# EasyEDA Pro project МПА-регистратор.eprj, schematic Schematic1

## Sheets
1 MCU: Board Name: Board1; Create Date: 2026-05-29; Page Name: MCU; Project Name: МПА-регистратор; Schematic Name: Schematic1; Update Date: 2026-09-03; Company: EasyEDA.com; Page Size: A4; Version: V1.0
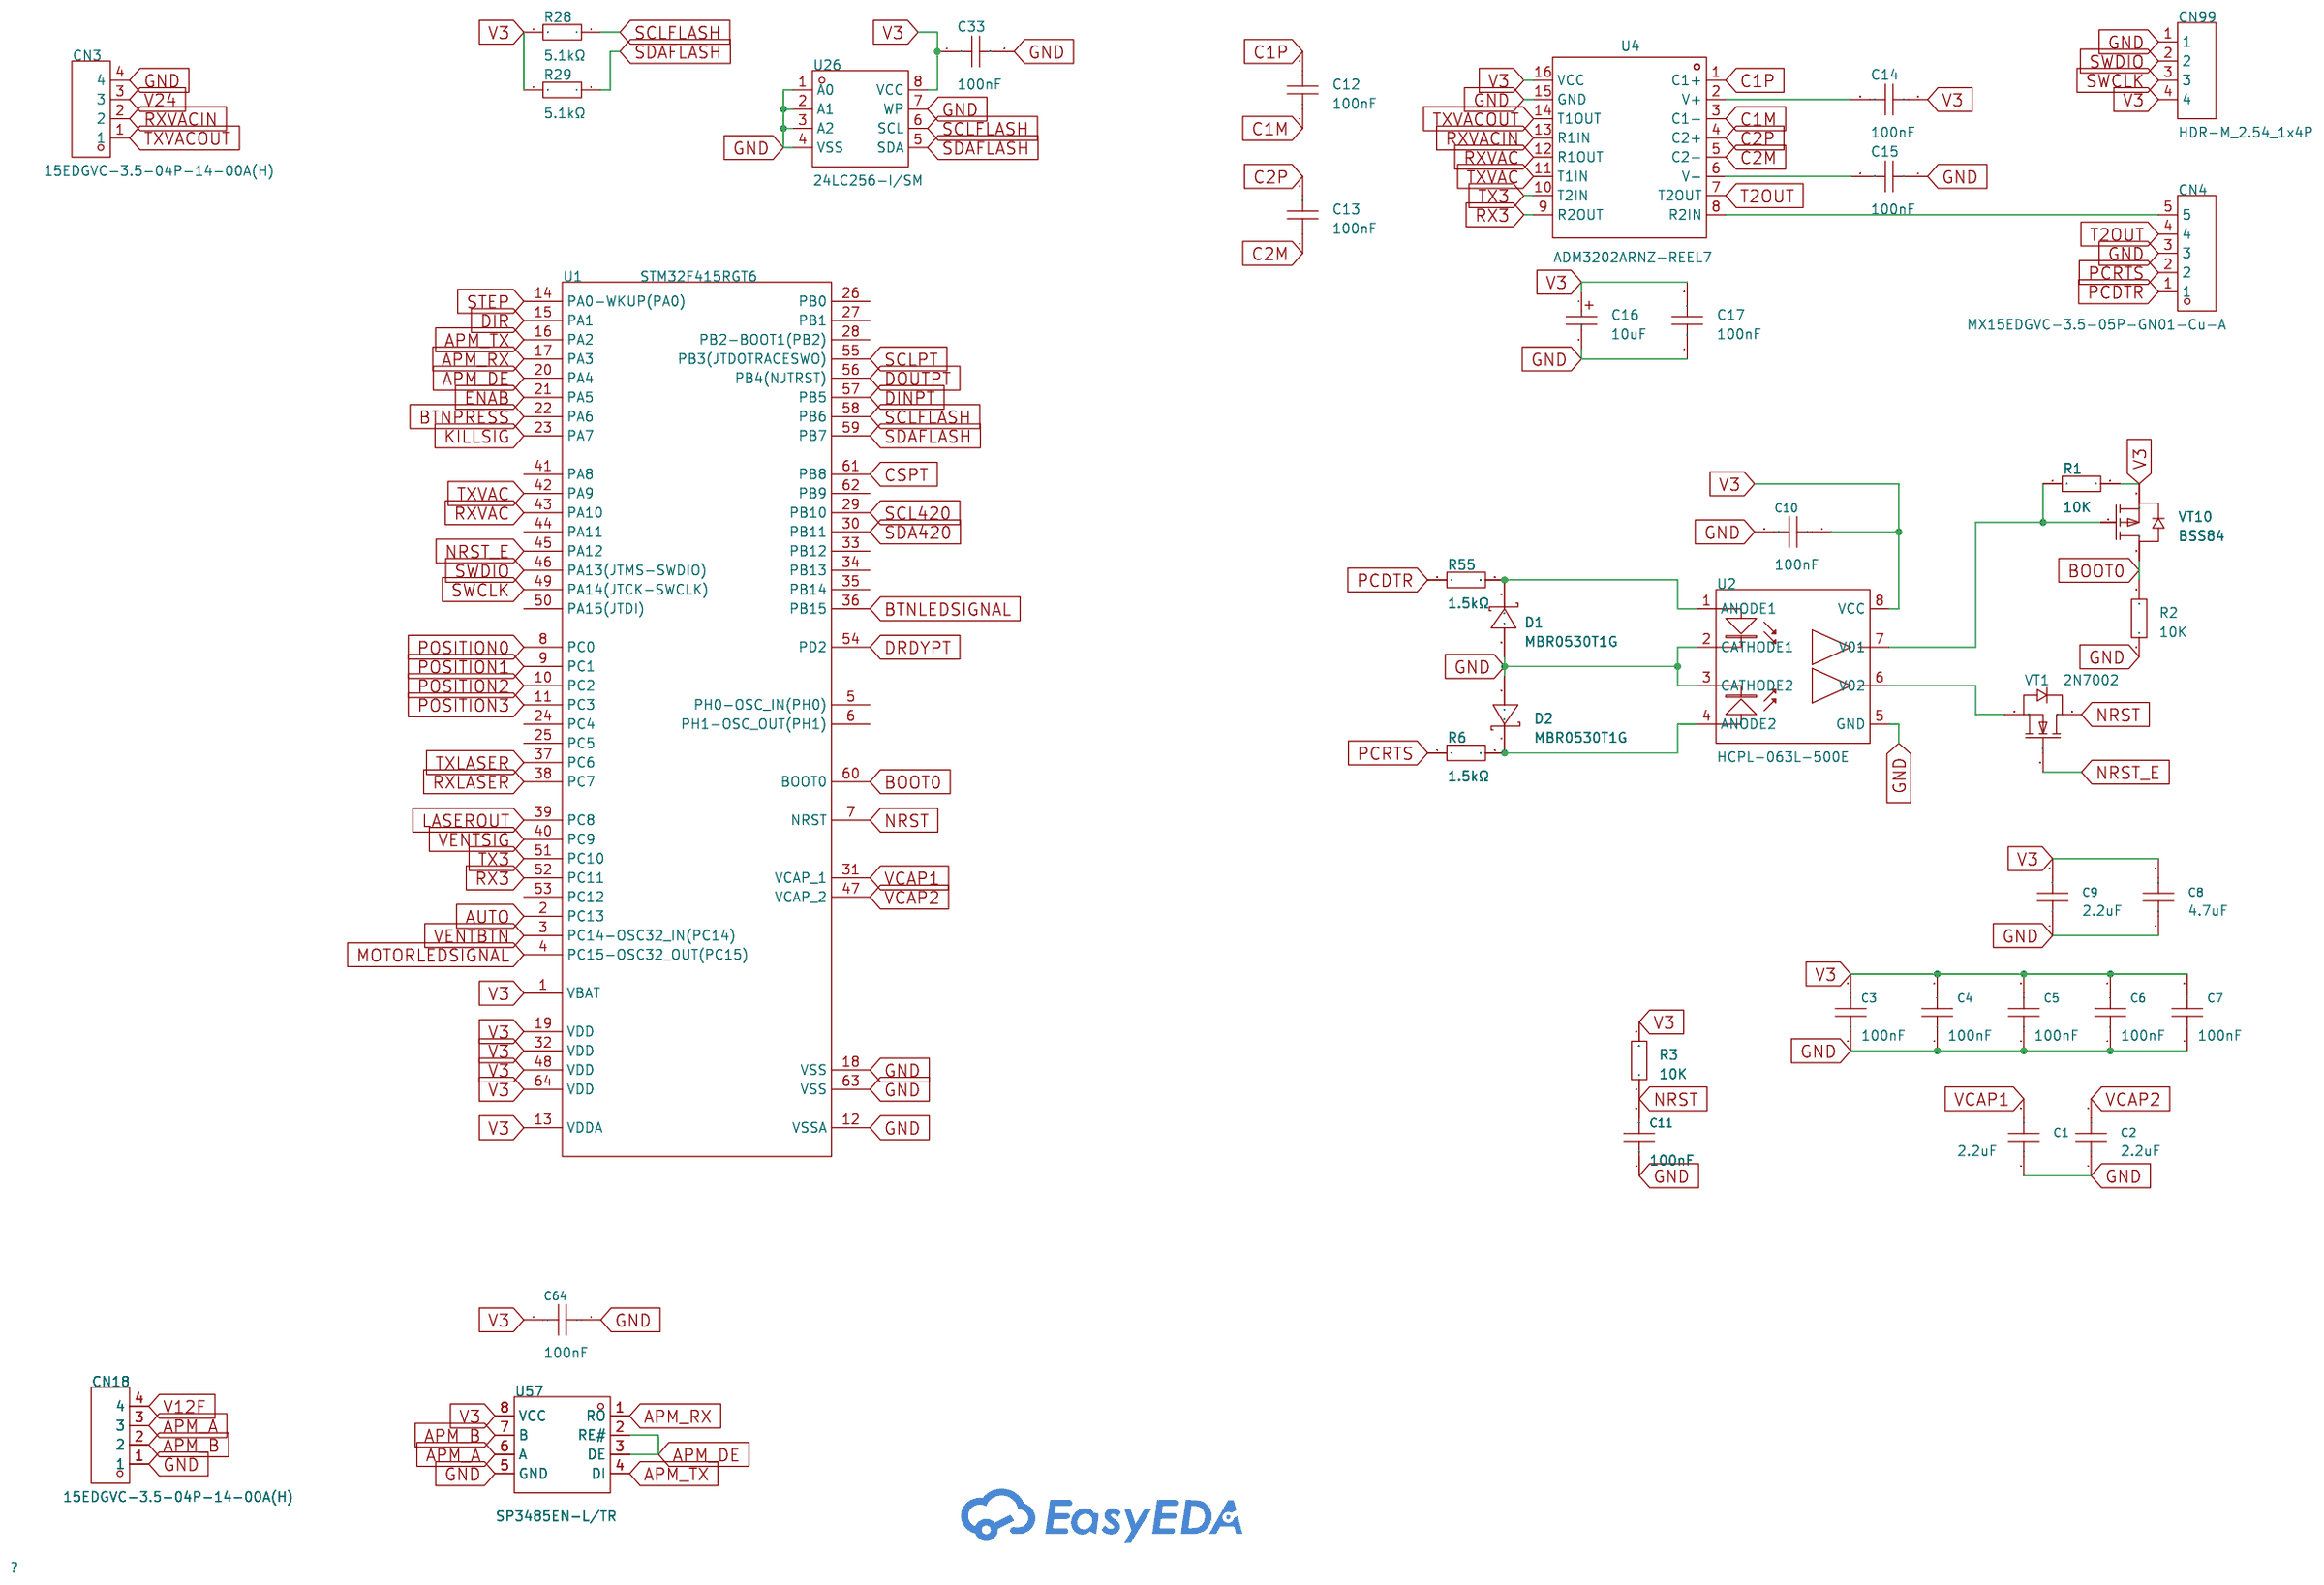
[diagram p0: MCU]
2 4-20: Create Date: 2026-06-09; Page Name: 4-20; Update Date: 2026-07-08
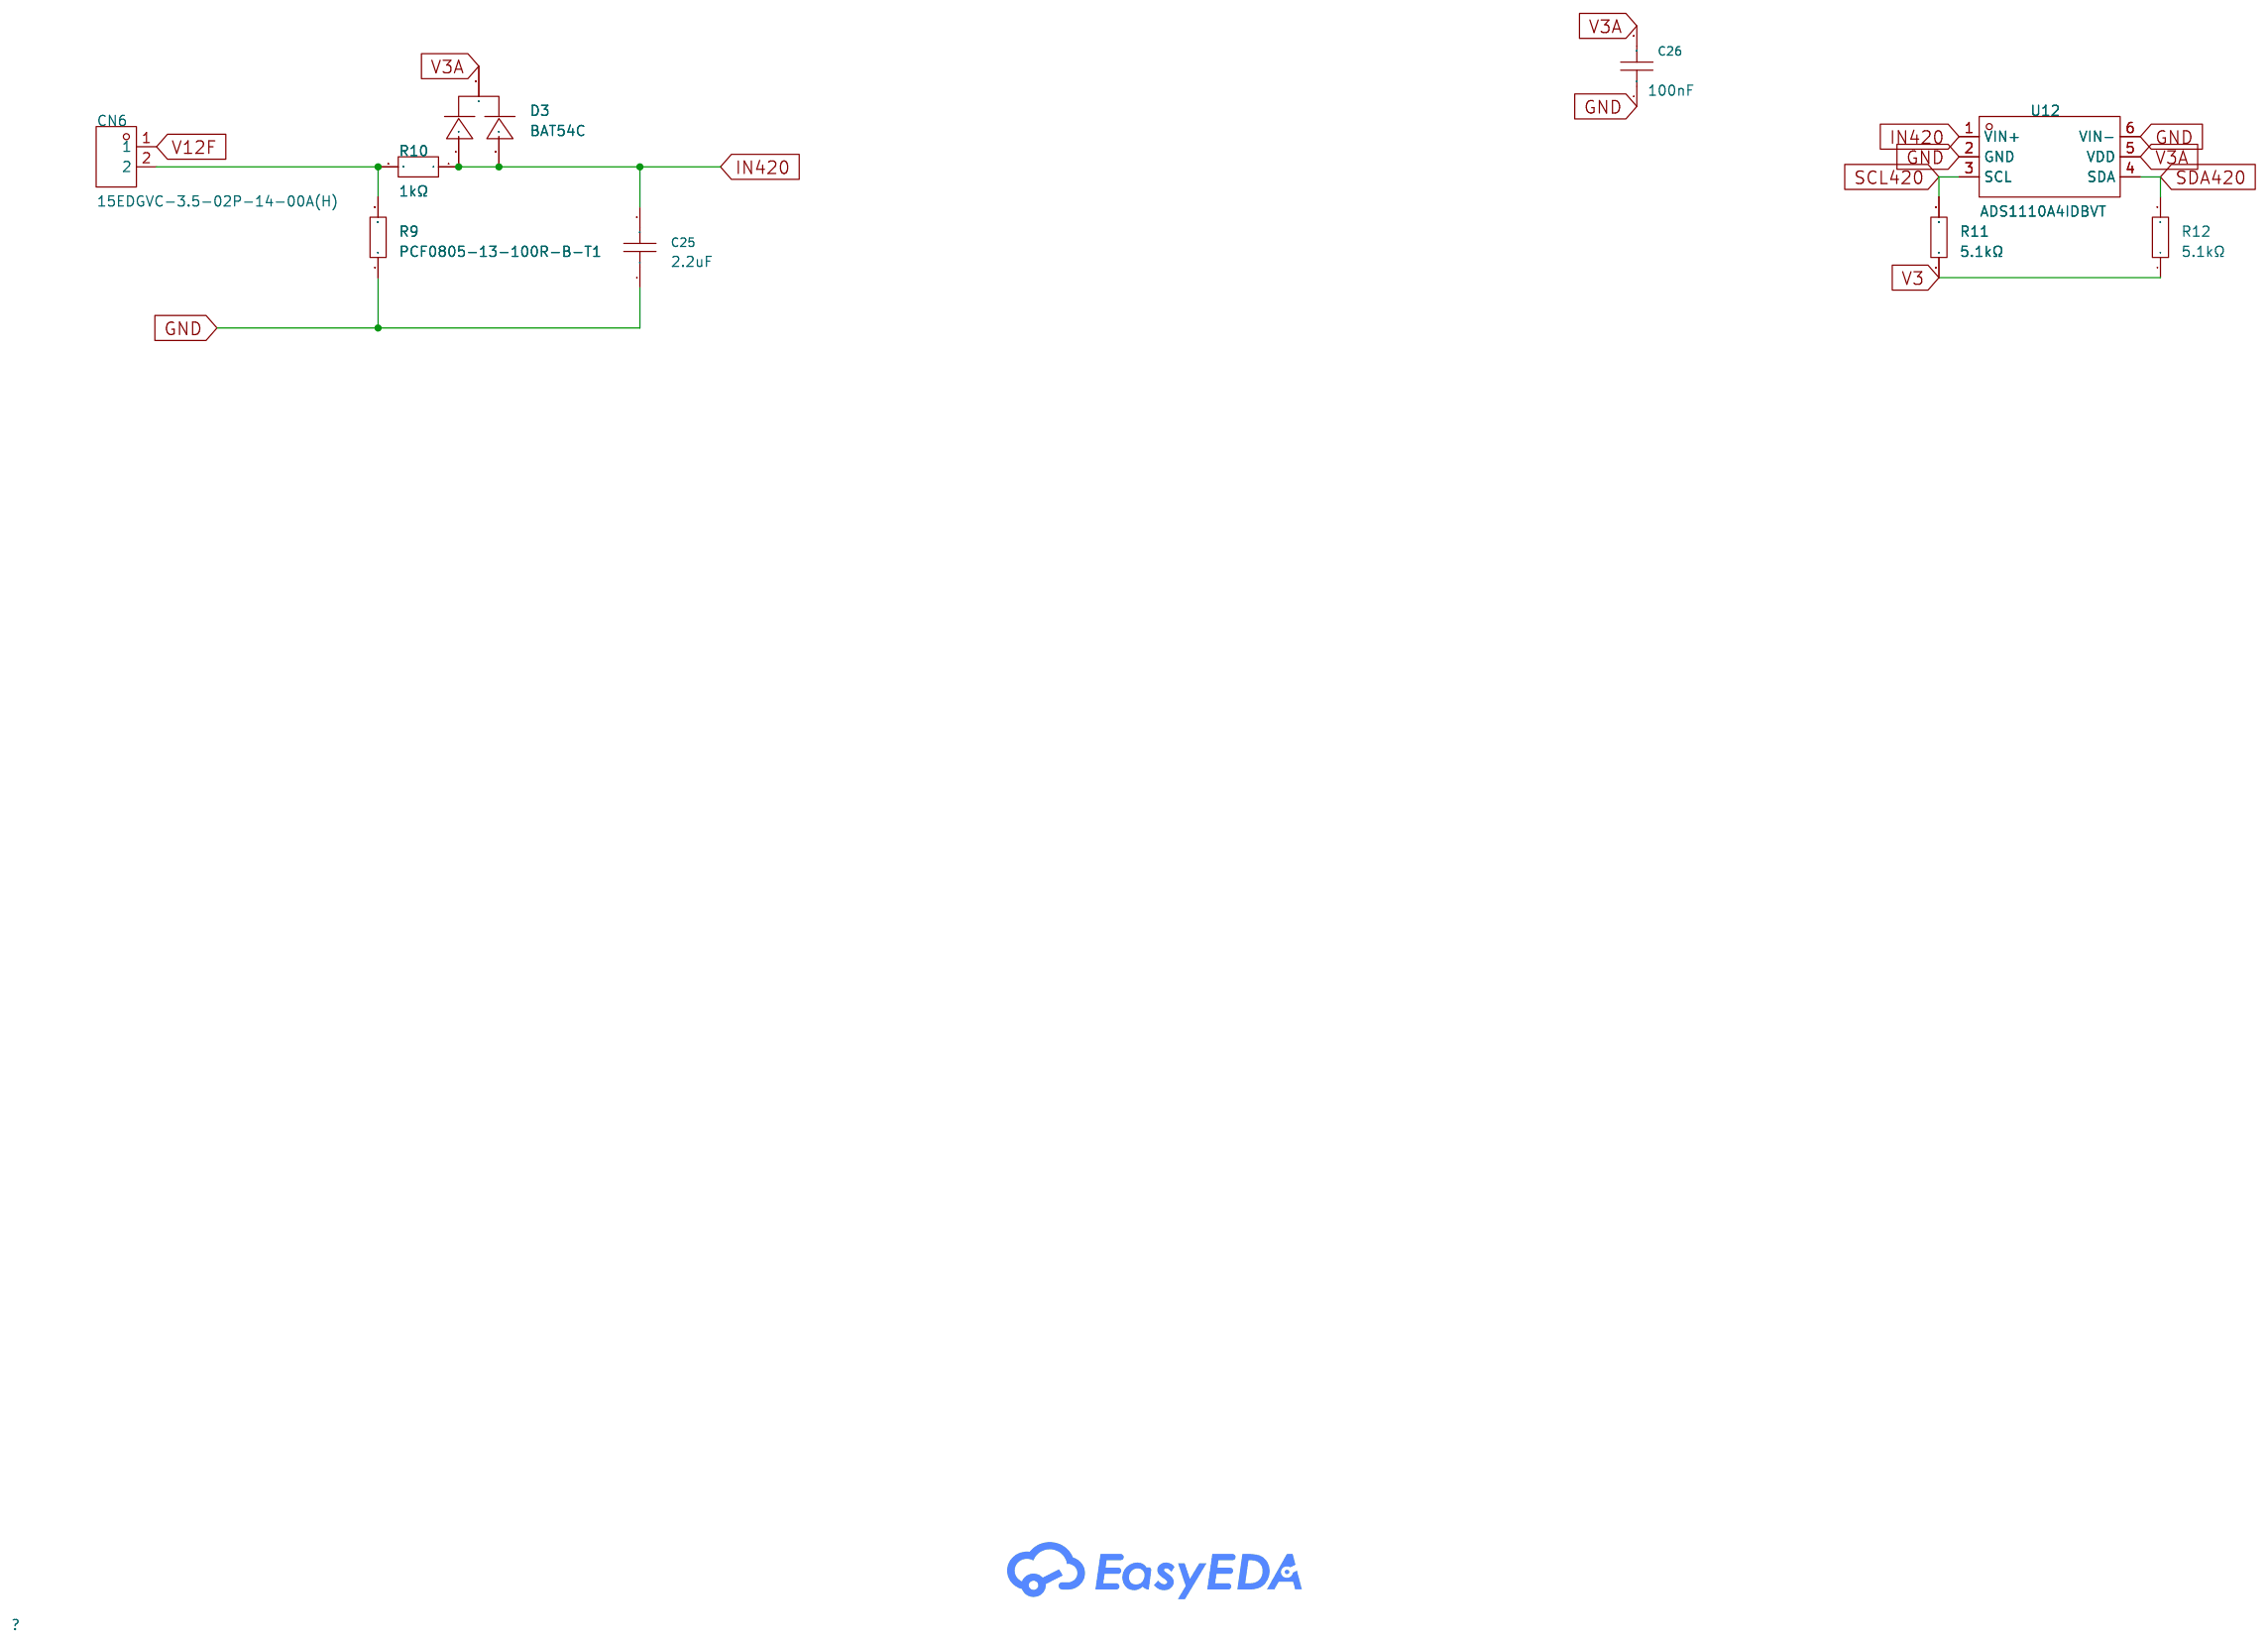
[diagram p1: 4-20]
3 Stepper: Create Date: 2026-06-09; Page Name: Stepper
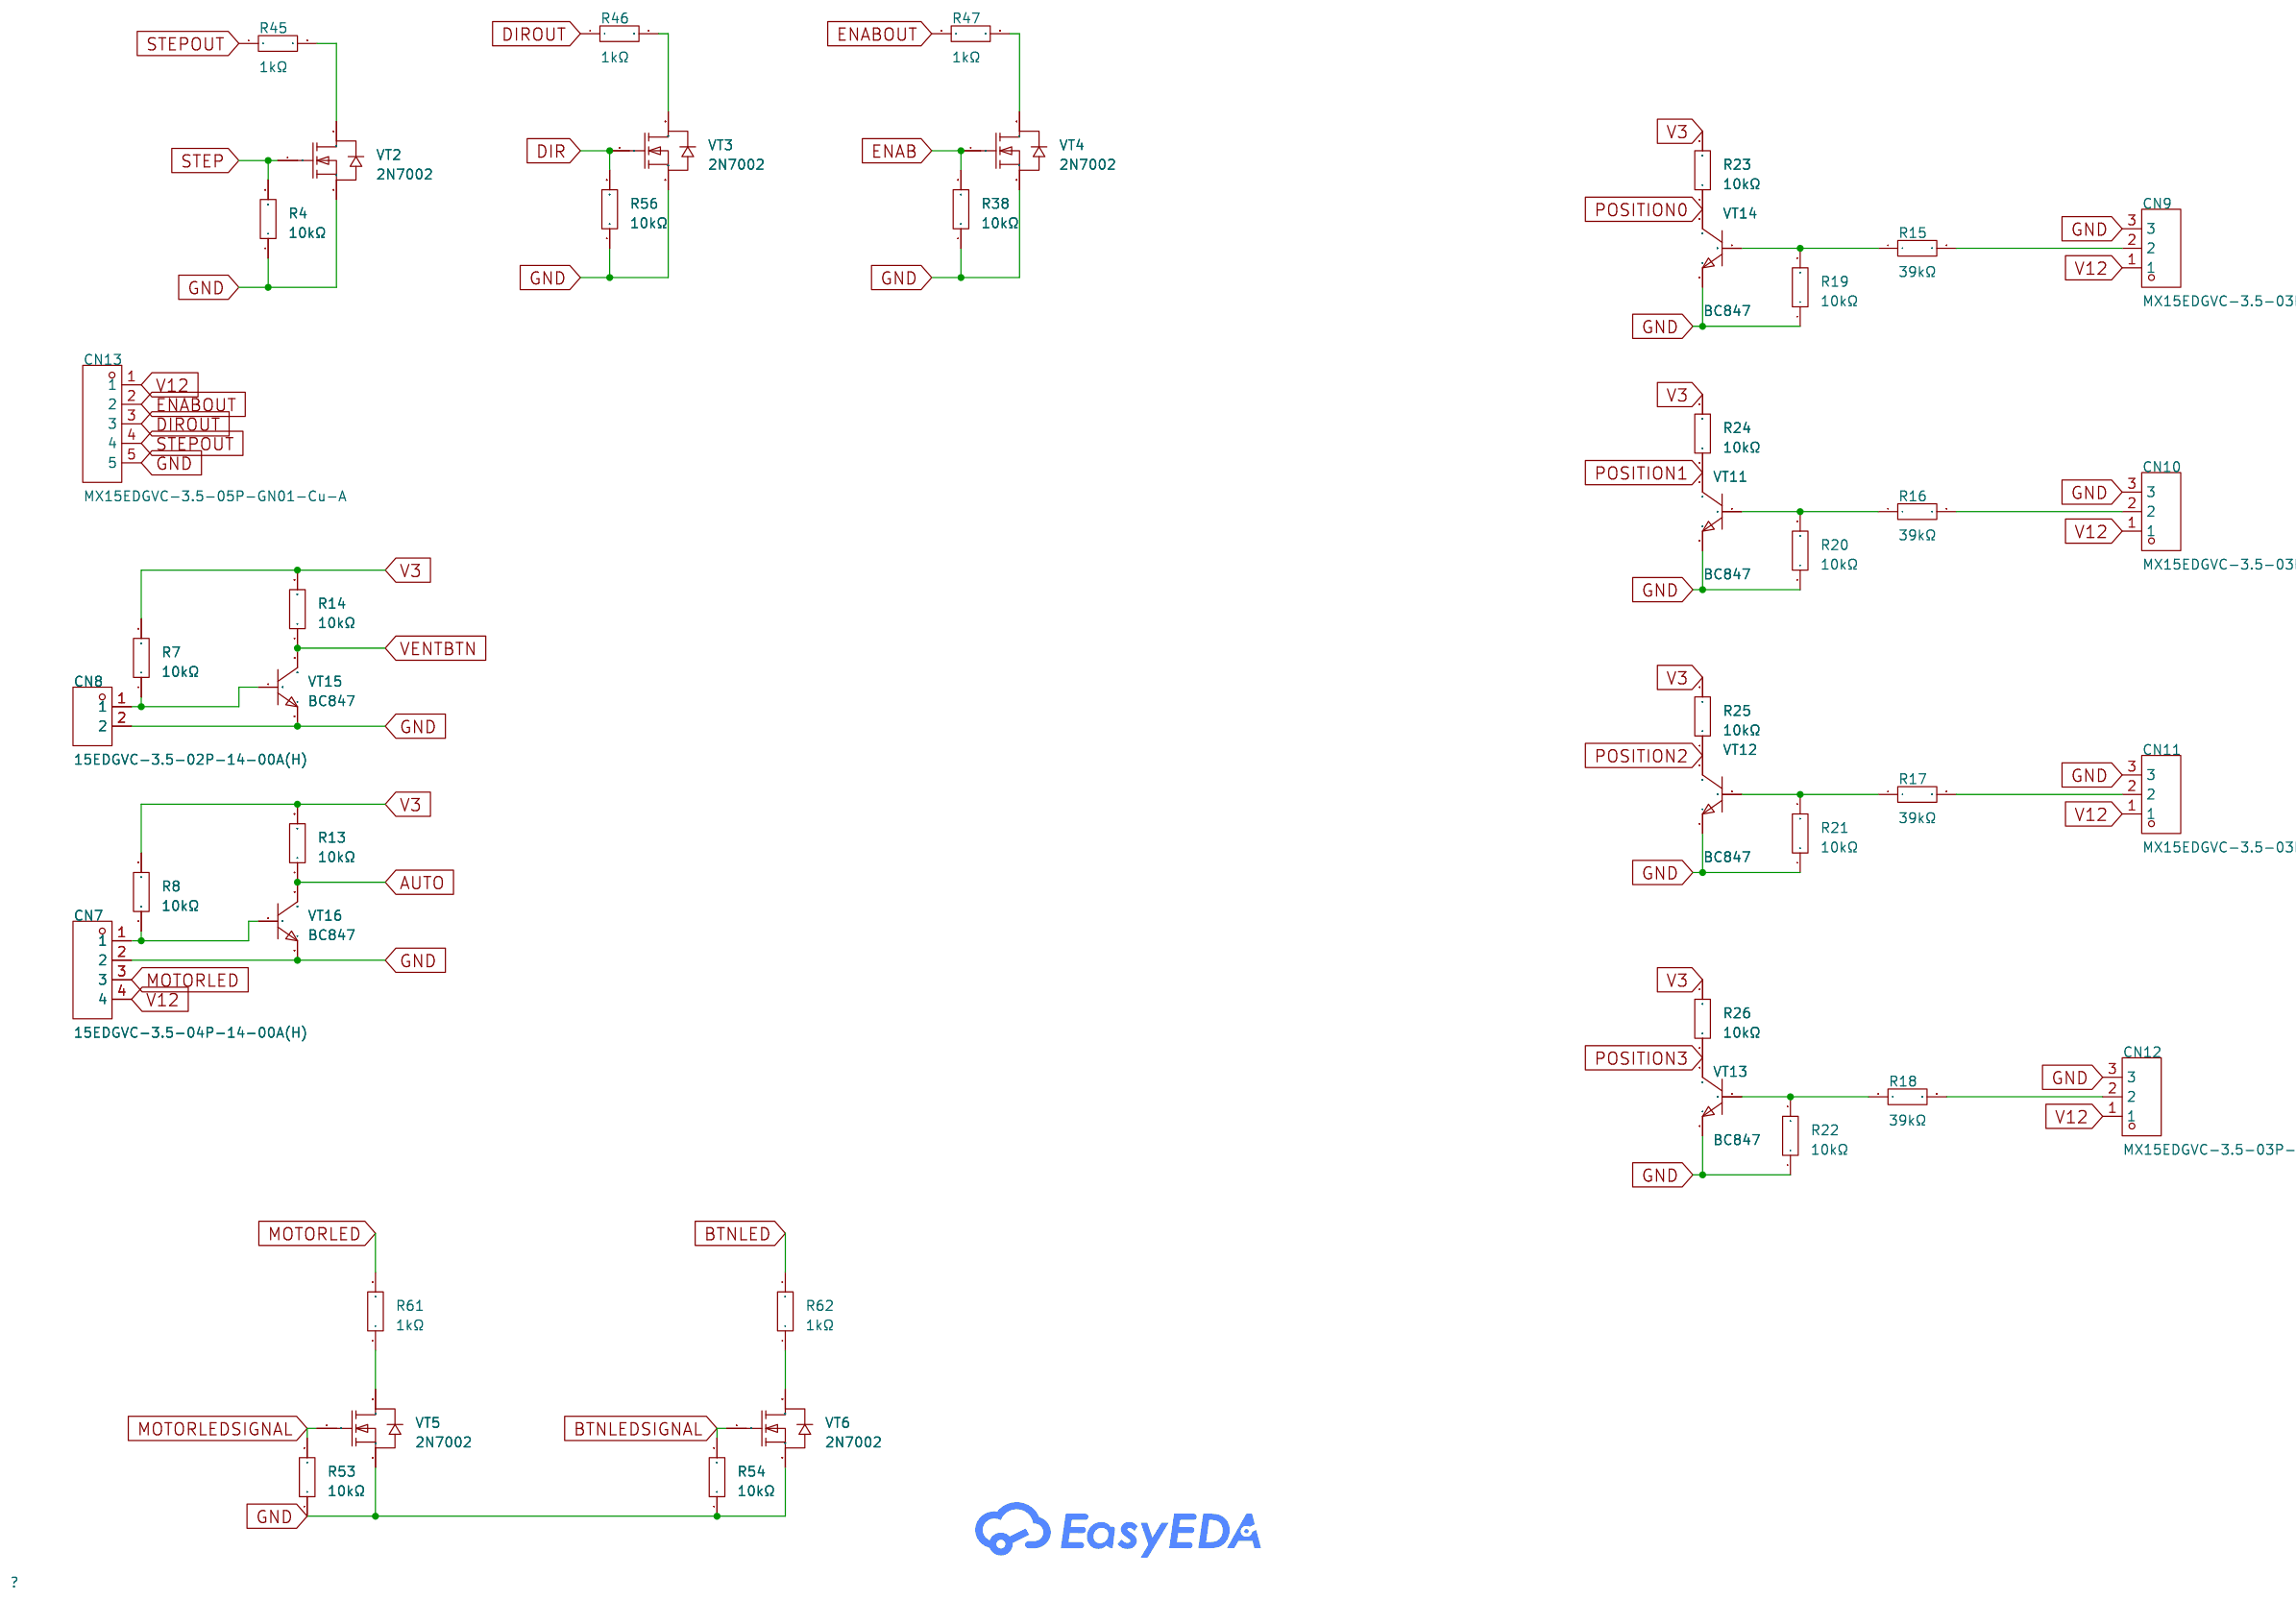
[diagram p2: Stepper]
4 Laser: Create Date: 2026-06-11; Page Name: Laser; Update Date: 2026-07-07
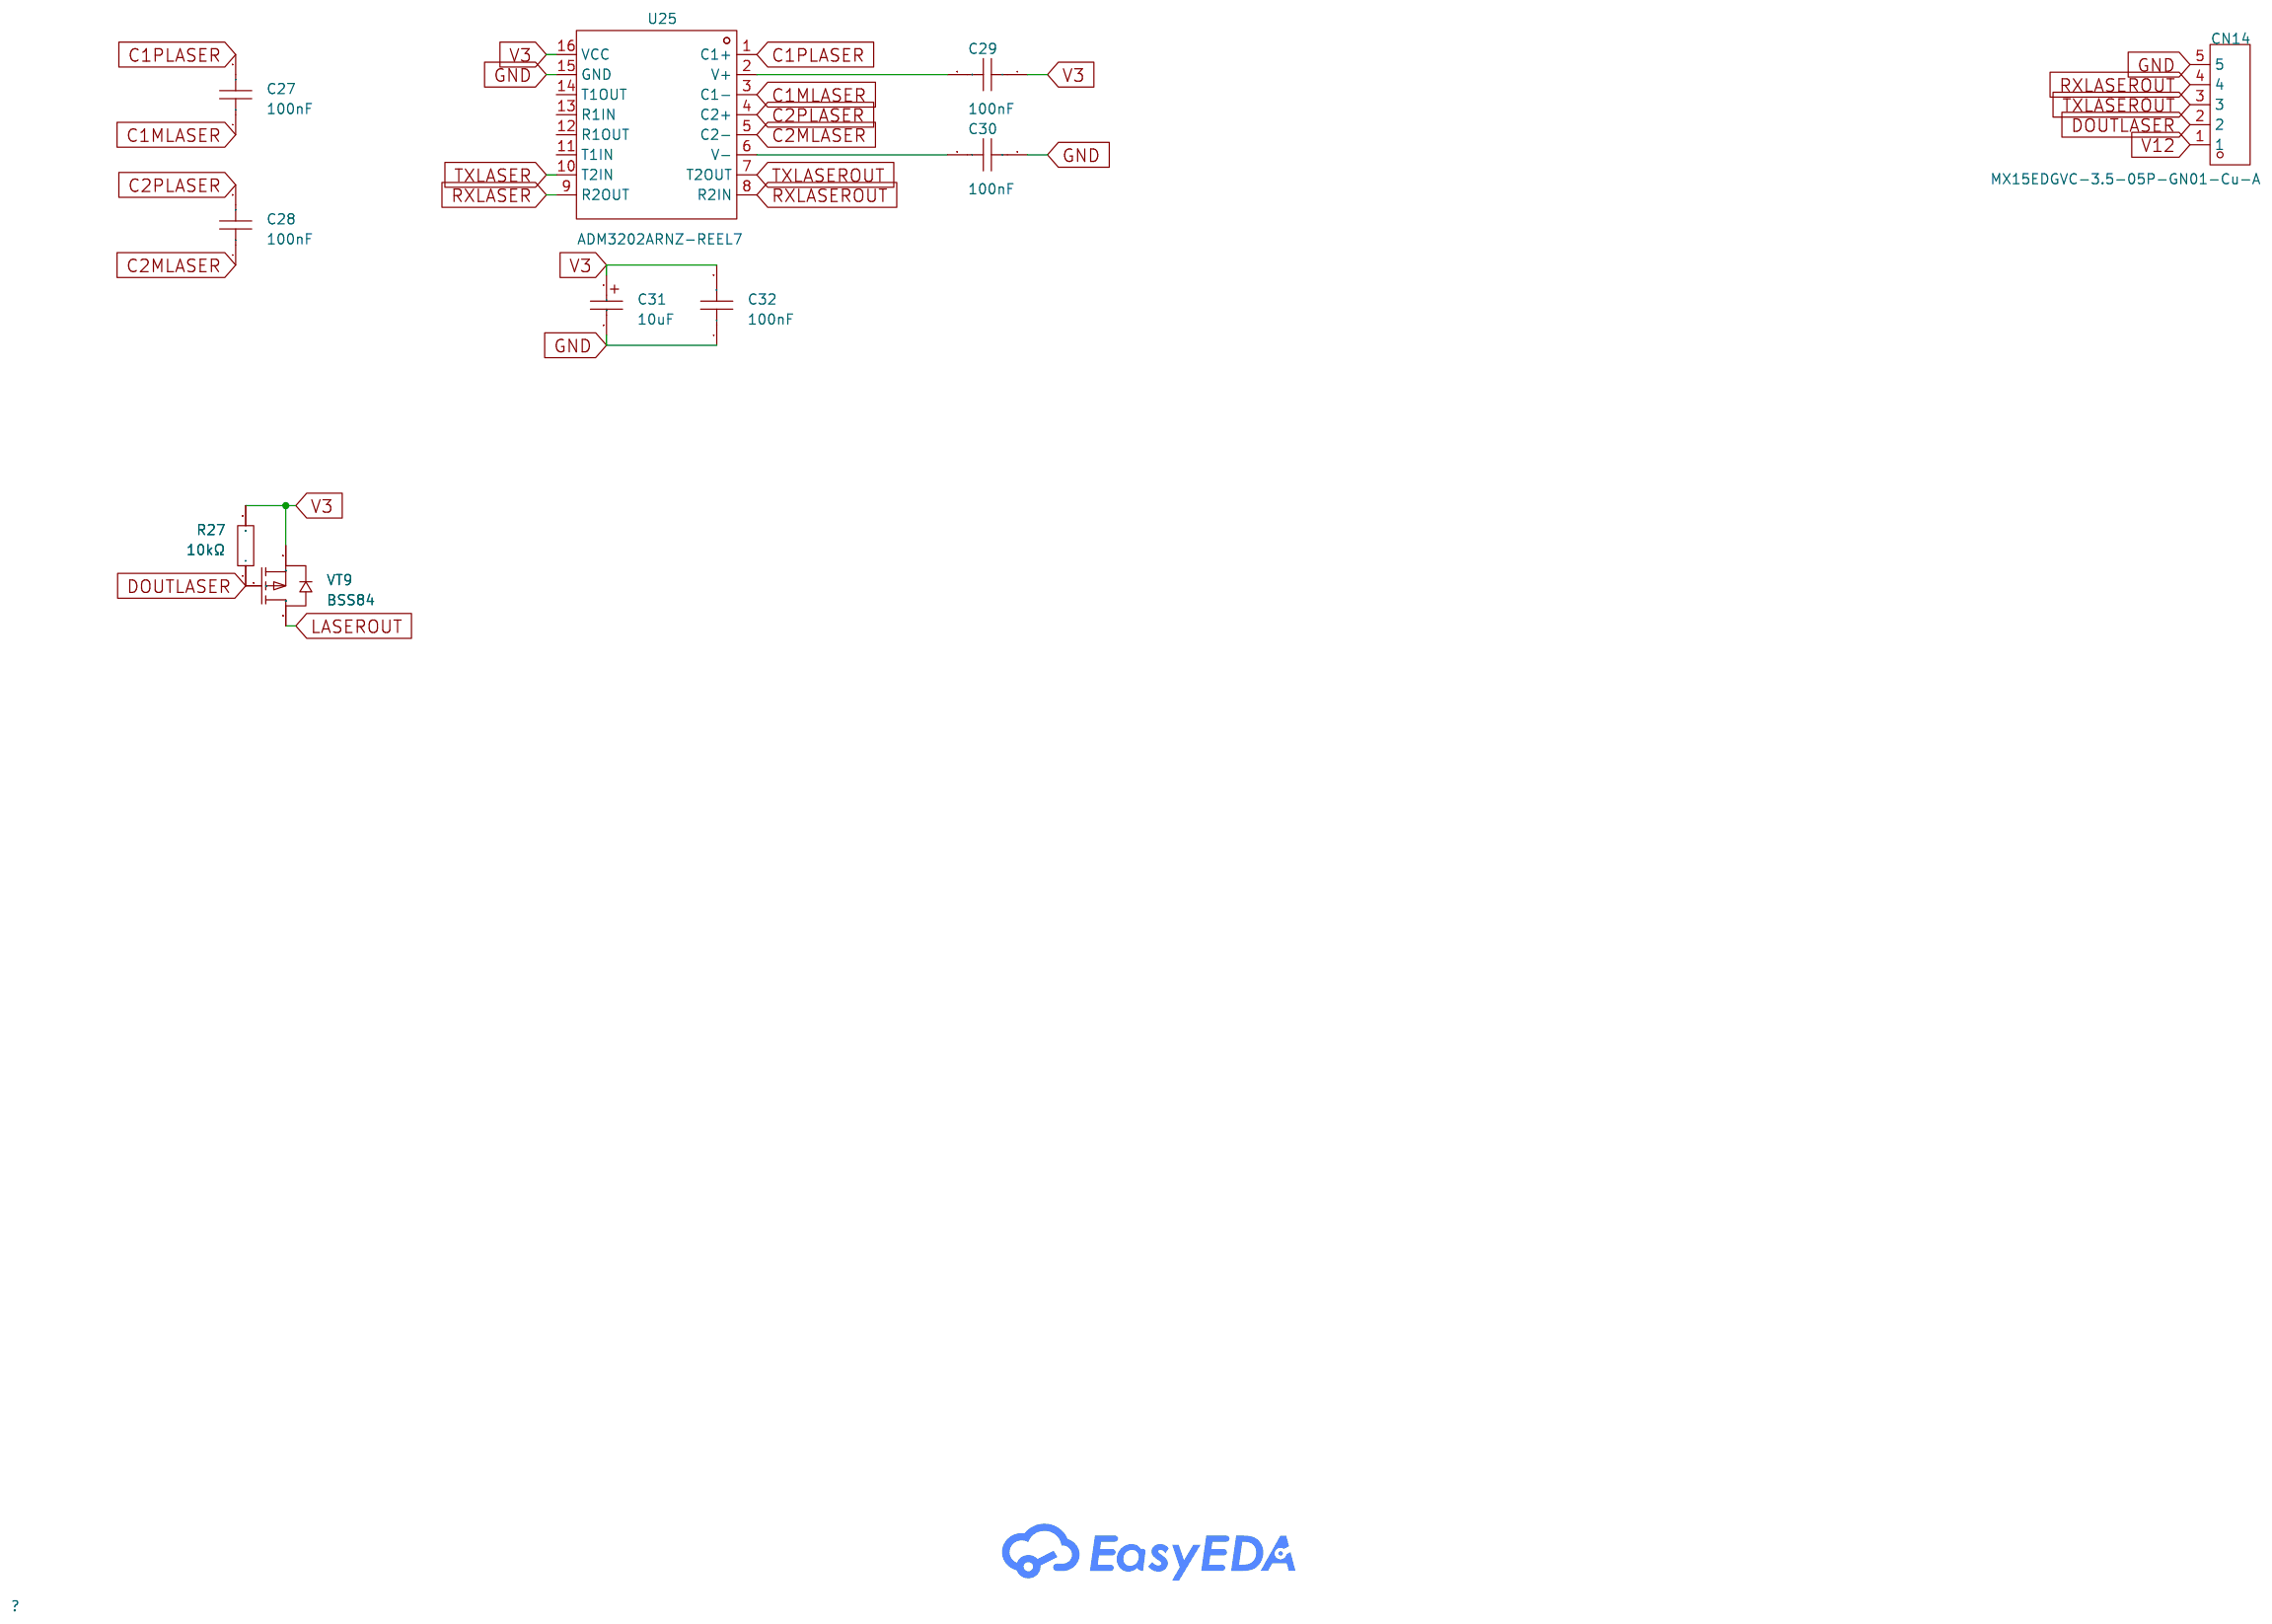
[diagram p3: Laser]
5 PWR: Create Date: 2026-06-11; Page Name: PWR; Update Date: 2026-07-08
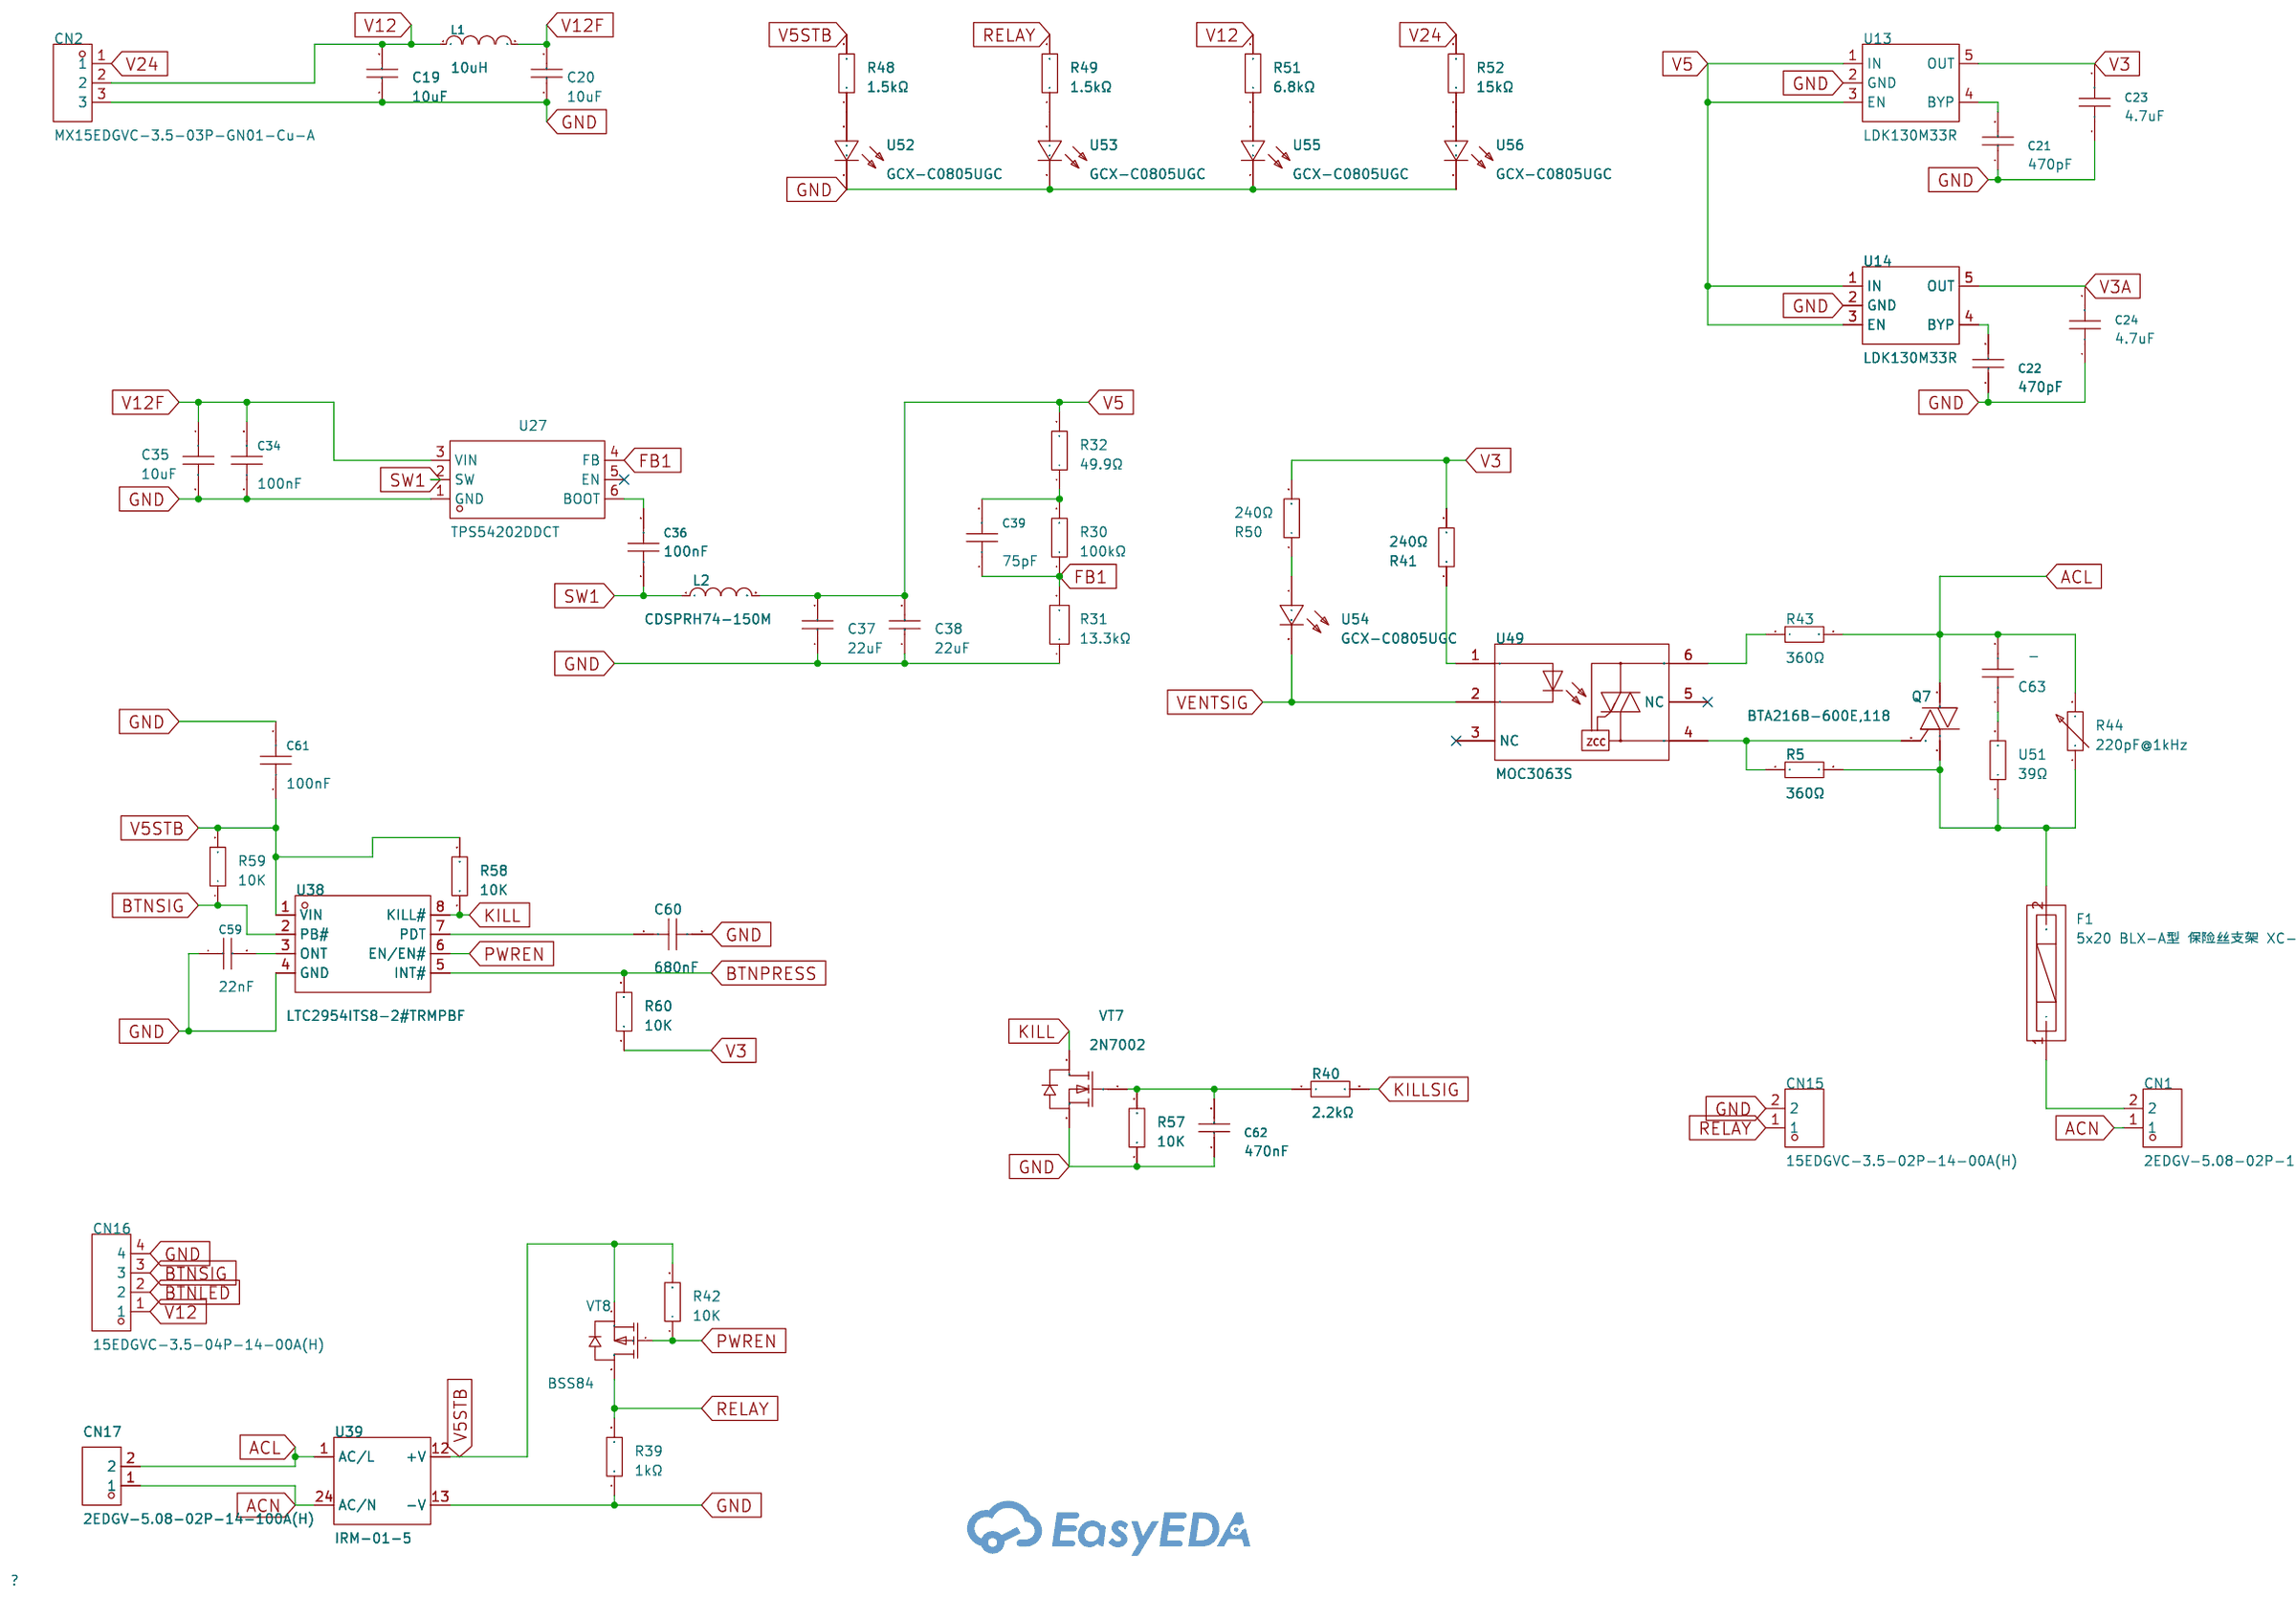
[diagram p4: PWR]
6 Pt100: Create Date: 2026-06-11; Page Name: Pt100; Update Date: 2026-06-30
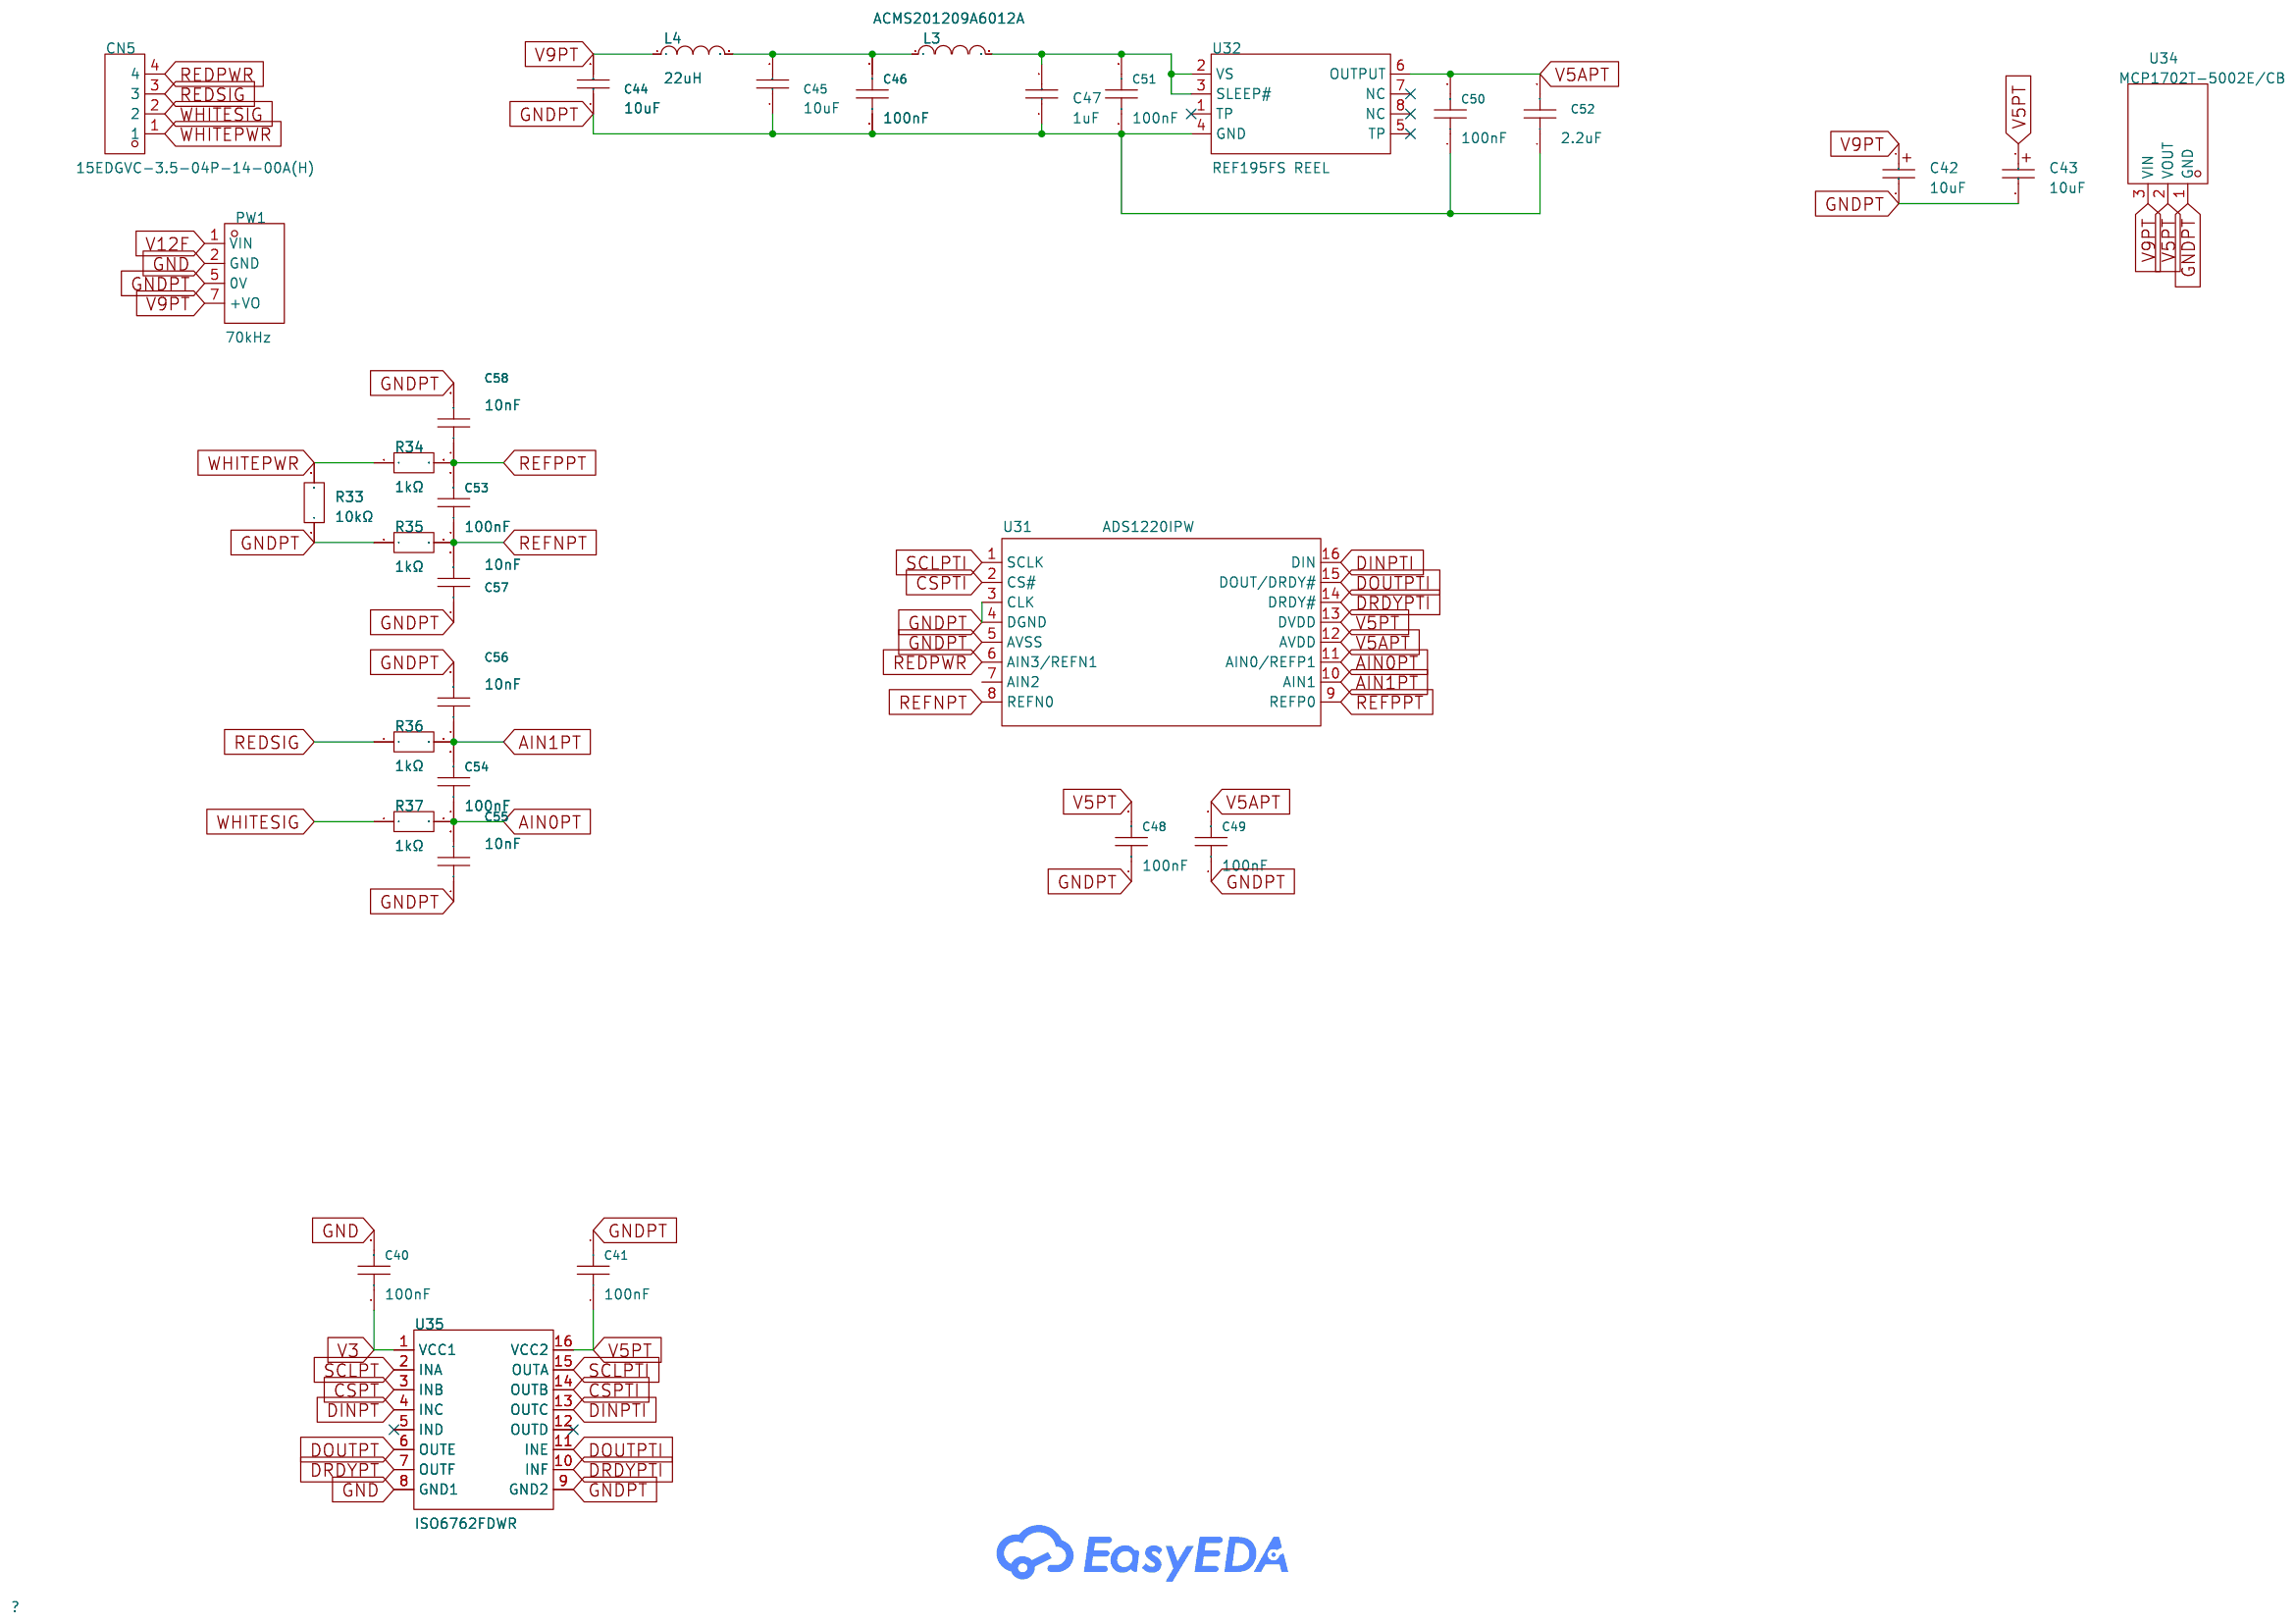
[diagram p5: Pt100]

## Parts
sheet 4-20
C25  2.2uF  [C0603]
C26  100nF  [C0603]
CN6  15EDGVC-3.5-02P-14-00A(H)  [CONN-TH_2P-P3.50_15EDGVC-3.5-02P-14-00AH]
D3  BAT54C  [SOT-23-3_L3.0-W1.7-P0.95-LS2.9-BR]
R9  100Ω  [R0805]
R10  1kΩ  [R0805]
R11  5.1kΩ  [R0805]
R12  5.1kΩ  [R0805]
U12  ADS1110A4IDBVT  [SOT-23-6_L2.9-W1.6-P0.95-LS2.8-BR]
sheet Laser
C27  100nF  [C0805]
C28  100nF  [C0805]
C29  100nF  [C0805]
C30  100nF  [C0805]
C31  10uF  [CASE-A_3216]
C32  100nF  [C0805]
CN14  MX15EDGVC-3.5-05P-GN01-Cu-A  [CONN-TH_5P-P3.50_MX15EDGV-3.5-GN01-05P-CU-A]
R27  10kΩ  [R0805]
U25  ADM3202ARNZ-REEL7  [SOIC-16_L9.9-W3.9-P1.27-LS6.0-BL]
VT9  BSS84  [SOT-23_L2.9-W1.3-P1.90-LS2.4-BR]
sheet MCU
C1  2.2uF  [C0603]
C2  2.2uF  [C0603]
C3  100nF  [C0603]
C4  100nF  [C0603]
C5  100nF  [C0603]
C6  100nF  [C0603]
C7  100nF  [C0603]
C8  4.7uF  [C0603]
C9  2.2uF  [C0603]
C10  100nF  [C0603]
C11  100nF  [C0603]
C12  100nF  [C0805]
C13  100nF  [C0805]
C14  100nF  [C0805]
C15  100nF  [C0805]
C16  10uF  [CASE-A_3216]
C17  100nF  [C0805]
C33  100nF  [C0805]
C64  100nF  [C0603]
CN3  15EDGVC-3.5-04P-14-00A(H)  [CONN-TH_4P-P3.50_TOPONELEC_15ETYVC-3.5-04P-14-00AH]
CN4  MX15EDGVC-3.5-05P-GN01-Cu-A  [CONN-TH_5P-P3.50_MX15EDGV-3.5-GN01-05P-CU-A]
CN18  15EDGVC-3.5-04P-14-00A(H)  [CONN-TH_4P-P3.50_TOPONELEC_15ETYVC-3.5-04P-14-00AH]
CN99  HDR-M_2.54_1x4P  [HDR-TH_HDR-M_2.54_1X4P]
D1  MBR0530T1G  [SOD-123_L2.7-W1.6-LS3.7-RD-1]
D2  MBR0530T1G  [SOD-123_L2.7-W1.6-LS3.7-RD-1]
R1  10K  [R0805]
R2  10K  [R0805]
R3  10K  [R0805]
R6  1.5kΩ  [R0805]
R28  5.1kΩ  [R0805]
R29  5.1kΩ  [R0805]
R55  1.5kΩ  [R0805]
U1  STM32F415RGT6  [LQFP-64_L10.0-W10.0-P0.50-LS12.0-BL]
U2  HCPL-063L-500E  [SO-8_L4.9-W3.9-P1.27-LS5.9-BL]
U4  ADM3202ARNZ-REEL7  [SOIC-16_L9.9-W3.9-P1.27-LS6.0-BL]
U26  24LC256-I/SM  [SOIJ-8_L5.3-W5.3-P1.27-LS7.9-BL]
U57  SP3485EN-L/TR  [SOIC-8_L5.0-W4.0-P1.27-LS6.0-BL]
VT1  2N7002  [SOT-23-3_L2.9-W1.4-P1.91-LS2.6-BR]
VT10  BSS84  [SOT-23_L2.9-W1.3-P1.90-LS2.4-BR]
sheet Pt100
C40  100nF  [C0603]
C41  100nF  [C0603]
C42  10uF  [CASE-A_3216]
C43  10uF  [CASE-A_3216]
C44  10uF  [C1210]
C45  10uF  [C1210]
C46  100nF  [C0603]
C47  1uF  [C0805]
C48  100nF  [C0603]
C49  100nF  [C0603]
C50  100nF  [C0603]
C51  100nF  [C0603]
C52  2.2uF  [C0603]
C53  100nF  [C0603]
C54  100nF  [C0603]
C55  10nF  [C0603]
C56  10nF  [C0603]
C57  10nF  [C0603]
C58  10nF  [C0603]
CN5  15EDGVC-3.5-04P-14-00A(H)  [CONN-TH_4P-P3.50_TOPONELEC_15ETYVC-3.5-04P-14-00AH]
L3  ACMS201209A6012A  [L0805]
L4  22uH  [IND-SMD_L4.5-W3.2]
PW1  70kHz  [PWRM-TH_JETEKPS_HXXXXS-1W_1]
R33  10kΩ  [R0805]
R34  1kΩ  [R0603]
R35  1kΩ  [R0603]
R36  1kΩ  [R0603]
R37  1kΩ  [R0603]
U31  ADS1220IPW  [TSSOP-16_L5.0-W4.4-P0.65-LS6.4-BL]
U32  REF195FS REEL  [SOIC-8_L4.9-W3.9-P1.27-LS6.0-BL]
U34  MCP1702T-5002E/CB  [SOT-23_L2.9-W1.3-P1.90-LS2.4-BR]
U35  ISO6762FDWR  [SOIC-16_L10.3-W7.5-P1.27-LS10.3-TL]
sheet PWR
C19  10uF  [C1206]
C20  10uF  [C1206]
C21  470pF  [C0805]
C22  470pF  [C0805]
C23  4.7uF  [C0603]
C24  4.7uF  [C0603]
C34  100nF  [C0603]
C35  10uF  [C1206]
C36  100nF  [C0603]
C37  22uF  [C1206]
C38  22uF  [C1206]
C39  75pF  [C0805]
C59  22nF  [C0805]
C60  680nF  [C0805]
C61  100nF  [C0603]
C62  470nF  [C0805]
C63  -  [CAP-TH_L13.0-W4.0-P10.00-D1.0]
CN1  2EDGV-5.08-02P-14-100A(H)  [CONN-TH_P5.08_2EDGV-5.08-02P-14-100A-H]
CN2  MX15EDGVC-3.5-03P-GN01-Cu-A  [CONN-TH_3P-P3.50_MX15EDGV-3.5-GN01-03P-CU-A]
CN15  15EDGVC-3.5-02P-14-00A(H)  [CONN-TH_2P-P3.50_15EDGVC-3.5-02P-14-00AH]
CN16  15EDGVC-3.5-04P-14-00A(H)  [CONN-TH_4P-P3.50_TOPONELEC_15ETYVC-3.5-04P-14-00AH]
CN17  2EDGV-5.08-02P-14-100A(H)  [CONN-TH_P5.08_2EDGV-5.08-02P-14-100A-H]
F1  5x20 BLX-A型 保险丝支架 XC-7  [FUSE-TH_L22.6-W9.0]
L1  10uH  [IND-SMD_L4.0-W4.0_SMNR4012]
L2  CDSPRH74-150M  [IND-SMD_L7.3-W7.3]
Q7  BTA216B-600E,118  [D2PAK_L10.2-W9.0-P5.08-LS15.9-BR]
R5  360Ω  [R1206]
R30  100kΩ  [R0805_NEW]
R31  13.3kΩ  [R0805]
R32  49.9Ω  [R0805]
R39  1kΩ  [R0805]
R40  2.2kΩ  [R0805]
R41  240Ω  [R0805]
R42  10K  [R0805]
R43  360Ω  [R1206]
R44  220pF@1kHz  [RES-TH_L12.5-W5.1-P7.50-D0.9-S5.10]
R48  1.5kΩ  [R0805]
R49  1.5kΩ  [R0805]
R50  240Ω  [R0805]
R51  6.8kΩ  [R0805]
R52  15kΩ  [R0805]
R57  10K  [R0805]
R58  10K  [R0805]
R59  10K  [R0805]
R60  10K  [R0805]
U13  LDK130M33R  [SOT-23-5_L3.0-W1.6-P0.95-LS2.8-BL]
U14  LDK130M33R  [SOT-23-5_L3.0-W1.6-P0.95-LS2.8-BL]
U27  TPS54202DDCT  [SOT-23-6_L2.9-W1.6-P0.95-LS2.8-BR]
U38  LTC2954ITS8-2#TRMPBF  [TSOT-23-8_L2.9-W1.6-P0.65-LS2.8-BL]
U39  IRM-01-5  [PWRM-TH_L33.7-W22.2_IRM-01-12]
U49  MOC3063S  [SMD-6_L7.3-W6.5-P2.54-LS10.0-BL]
U51  39Ω  [RES-TH_BD4.5-L11.5-P15.50-D0.7]
U52  GCX-C0805UGC  [LED0805-R-RD_GREEN]
U53  GCX-C0805UGC  [LED0805-R-RD_GREEN]
U54  GCX-C0805UGC  [LED0805-R-RD_GREEN]
U55  GCX-C0805UGC  [LED0805-R-RD_GREEN]
U56  GCX-C0805UGC  [LED0805-R-RD_GREEN]
VT7  2N7002  [SOT-23-3_L2.9-W1.4-P1.91-LS2.6-BR]
VT8  BSS84  [SOT-23_L2.9-W1.3-P1.90-LS2.4-BR]
sheet Stepper
CN7  15EDGVC-3.5-04P-14-00A(H)  [CONN-TH_4P-P3.50_TOPONELEC_15ETYVC-3.5-04P-14-00AH]
CN8  15EDGVC-3.5-02P-14-00A(H)  [CONN-TH_2P-P3.50_15EDGVC-3.5-02P-14-00AH]
CN9  MX15EDGVC-3.5-03P-GN01-Cu-A  [CONN-TH_3P-P3.50_MX15EDGV-3.5-GN01-03P-CU-A]
CN10  MX15EDGVC-3.5-03P-GN01-Cu-A  [CONN-TH_3P-P3.50_MX15EDGV-3.5-GN01-03P-CU-A]
CN11  MX15EDGVC-3.5-03P-GN01-Cu-A  [CONN-TH_3P-P3.50_MX15EDGV-3.5-GN01-03P-CU-A]
CN12  MX15EDGVC-3.5-03P-GN01-Cu-A  [CONN-TH_3P-P3.50_MX15EDGV-3.5-GN01-03P-CU-A]
CN13  MX15EDGVC-3.5-05P-GN01-Cu-A  [CONN-TH_5P-P3.50_MX15EDGV-3.5-GN01-05P-CU-A]
R4  10kΩ  [R0805]
R7  10kΩ  [R0805]
R8  10kΩ  [R0805]
R13  10kΩ  [R0805]
R14  10kΩ  [R0805]
R15  39kΩ  [R0805]
R16  39kΩ  [R0805]
R17  39kΩ  [R0805]
R18  39kΩ  [R0805]
R19  10kΩ  [R0805]
R20  10kΩ  [R0805]
R21  10kΩ  [R0805]
R22  10kΩ  [R0805]
R23  10kΩ  [R0805]
R24  10kΩ  [R0805]
R25  10kΩ  [R0805]
R26  10kΩ  [R0805]
R38  10kΩ  [R0805]
R45  1kΩ  [R0805]
R46  1kΩ  [R0805]
R47  1kΩ  [R0805]
R53  10kΩ  [R0805]
R54  10kΩ  [R0805]
R56  10kΩ  [R0805]
R61  1kΩ  [R0805]
R62  1kΩ  [R0805]
VT2  2N7002  [SOT-23-3_L2.9-W1.4-P1.91-LS2.6-BR]
VT3  2N7002  [SOT-23-3_L2.9-W1.4-P1.91-LS2.6-BR]
VT4  2N7002  [SOT-23-3_L2.9-W1.4-P1.91-LS2.6-BR]
VT5  2N7002  [SOT-23-3_L2.9-W1.4-P1.91-LS2.6-BR]
VT6  2N7002  [SOT-23-3_L2.9-W1.4-P1.91-LS2.6-BR]
VT11  BC847  [SOT-23-3_L2.9-W1.3-P1.90-LS2.3-BR-1]
VT12  BC847  [SOT-23-3_L2.9-W1.3-P1.90-LS2.3-BR-1]
VT13  BC847  [SOT-23-3_L2.9-W1.3-P1.90-LS2.3-BR-1]
VT14  BC847  [SOT-23-3_L2.9-W1.3-P1.90-LS2.3-BR-1]
VT15  BC847  [SOT-23-3_L2.9-W1.3-P1.90-LS2.3-BR-1]
VT16  BC847  [SOT-23-3_L2.9-W1.3-P1.90-LS2.3-BR-1]

## Library data of the parts
C1 C2 C9 C25 C52 = CC0603KRX7R5BB225: LCSC Part Name: 2.2uF ±10% 6.3V; Supplier Part: C914880; Manufacturer: YAGEO(国巨); Supplier Footprint: 0603; JLCPCB Part Class: Extended Part; Datasheet: https://item.szlcsc.com/datasheet/CC0603KRX7R5BB225/986222.html; Supplier: LCSC; Tolerance: ±10%; Voltage Rating: 6.3V; Temperature Coefficient: X7R
C3-C7 C10 C11 C26 C34 C36 C40 C41 C46 C48-C51 C53 C54 C61 C64 = CL10B104KB8NNNC: LCSC Part Name: 100nF ±10% 50V; Supplier Part: C1591; Manufacturer: SAMSUNG(三星); Supplier Footprint: 0603; JLCPCB Part Class: Extended Part; Datasheet: https://item.szlcsc.com/datasheet/CL10B104KB8NNNC/1943.html; Supplier: LCSC; Tolerance: ±10%; Voltage Rating: 50V; Temperature Coefficient: X7R
CN6 CN8 CN15 = 15EDGVC-3.5-02P-14-00A(H): Supplier Part: C9900019003; Supplier Footprint: CONN-TH; JLCPCB Part Class: Extended Part; Supplier: LCSC
D3 = BAT54C: LCSC Part Name: 电压:30V 电流:200mA; Supplier Part: C236933; Supplier Footprint: SOT-23-3L; JLCPCB Part Class: Extended Part; Supplier: LCSC; Forward Voltage (Vf@If): 800mV@100mA; Reverse Voltage (Vr): 30V; Average Rectified Current (Io): 200mA
R9 = 0805W8F1000T5E_C17408: LCSC Part Name: 100Ω ±1% 125mW 厚膜电阻; Supplier Part: C17408; Manufacturer: UNI-ROYAL(厚声); Manufacturer Part: 0805W8F1000T5E; Supplier Footprint: 0805; JLCPCB Part Class: Basic Part; Datasheet: https://atta.szlcsc.com/upload/public/pdf/source/20200306/C422600_1E6D84923E4A46A82E41ADD87F860B5C.pdf; Supplier: LCSC; Type: Thick Film Resistors; Tolerance: ±1%; Temperature Coefficient: ±100ppm/℃; Operating Temperature Range: -55℃~+155℃
R10 = RCT051KJLF: LCSC Part Name: 1kΩ ±5% 125mW; Supplier Part: C702836; Manufacturer: HKR(香港电阻); Supplier Footprint: 0805; JLCPCB Part Class: Extended Part; Datasheet: https://atta.szlcsc.com/upload/public/pdf/source/20180327/C185769_D03C9885E3618D1189E898A32FE91026.pdf; Supplier: LCSC; Tolerance: ±5%
R11 R12 R28 R29 = RC0805FR-075K1L: LCSC Part Name: 厚膜电阻 5.1kΩ ±1% 125mW; Supplier Part: C84375; Manufacturer: YAGEO(国巨); Supplier Footprint: 0805; JLCPCB Part Class: Extended Part; Datasheet: https://item.szlcsc.com/datasheet/RC0805FR-075K1L/85545.html; Supplier: LCSC; Type: Thick Film Resistor; Tolerance: ±1%; Power(Watts): 125mW; Voltage-Supply(Max): 150V; Temperature Coefficient: ±100ppm/℃; Operating Temperature: -55℃~+155℃
U12 = ADS1110A4IDBVT: Supplier Part: C1016161; Manufacturer: TI(德州仪器); Supplier Footprint: SOT-23-6; JLCPCB Part Class: Extended Part; Datasheet: https://www.ti.com/cn/lit/gpn/ads1110; Supplier: LCSC; Resolution(Bits): 16-Bit; Sampling Rate: 240Hz; Voltage - Supply: 2.7V~5.5V; Interface: I2C; differential input: Yes; Operating Temperature: -40℃~+125℃
C12-C15 C17 C27-C30 C32 C33 = GRM21BR71H104KA01L: LCSC Part Name: 100nF ±10% 50V; Supplier Part: C77082; Manufacturer: muRata(村田); Supplier Footprint: 0805; JLCPCB Part Class: Extended Part; Datasheet: https://item.szlcsc.com/datasheet/GRM21BR71H104KA01L/78209.html; Supplier: LCSC; Tolerance: ±10%; Voltage Rating: 50V; Temperature Coefficient: X7R
C16 C31 C42 C43 = T491A106K016AT: LCSC Part Name: 10uF ±10% 16V; Supplier Part: C110055; Manufacturer: KEMET(基美); Supplier Footprint: CASE-A-3216-18(mm); JLCPCB Part Class: Extended Part; Datasheet: https://atta.szlcsc.com/upload/public/pdf/source/20190402/C118128_17DC26F5D7668F0165447CB640F1E367.pdf; Supplier: LCSC; Tolerance: ±10%; Equivalent Series Resistance(ESR): 3Ω@100kHz; Operating Temperature: -55℃~+125℃
CN4 CN13 CN14 = MX15EDGVC-3.5-05P-GN01-Cu-A: LCSC Part Name: 1x5P 3.5mm 排数:1 每排P数:5; Supplier Part: C5188321; Manufacturer: MAX(迈旭); Supplier Footprint: 插件,P=3.5mm; JLCPCB Part Class: Extended Part; Datasheet: https://item.szlcsc.com/datasheet/MX15EDGVC-3.5-05P-GN01-Cu-A/5862405.html; Supplier: LCSC; Connector Type: Board Side/Socket - Closed; Number of Positions or Pins: 1x5P; Pitch: 3.5mm; Color: Green; Mounting Type: Through Hole; Number of Pins: 5P; Number of Rows: 1; Number of PINs Per Row: 5; Current Rating: 8A; Voltage Rating (Max): 300V; Operating Temperature: -40℃~+105℃
R4 R7 R8 R13 R14 R19-R27 R38 R53 R54 R56 = AC0805JR-0710KL: LCSC Part Name: 厚膜电阻 10kΩ ±5% 125mW; Supplier Part: C138260; Manufacturer: YAGEO(国巨); Supplier Footprint: 0805; JLCPCB Part Class: Extended Part; Datasheet: https://item.szlcsc.com/datasheet/AC0805JR-0710KL/149576.html; Supplier: LCSC; Type: Thick Film Resistor; Tolerance: ±5%; Power(Watts): 125mW; Voltage-Supply(Max): 150V; Temperature Coefficient: ±100ppm/℃; Operating Temperature: -55℃~+155℃
U4 U25 = ADM3202ARNZ-REEL7: LCSC Part Name: 低功耗，3.3 V，RS-232收发器; Supplier Part: C28106; Manufacturer: ADI(亚德诺); Supplier Footprint: SOIC-16; JLCPCB Part Class: Extended Part; Datasheet: https://atta.szlcsc.com/upload/public/pdf/source/20140724/1457707160156.pdf; Supplier: LCSC; Types: Transceiver; Number of Driver: 2; Number of receiver: 2; Data Rate: 460Kbps; Supply Voltage: 3V~5.5V; Operating Temperature: -40℃~+85℃
VT8-VT10 = BSS84: LCSC Part Name: 1个P沟道 耐压:50V 电流:0.13A; Supplier Part: C3018484; Manufacturer: FUXINSEMI(富芯森美); Supplier Footprint: SOT-23; JLCPCB Part Class: Extended Part; Datasheet: https://item.szlcsc.com/datasheet/BSS84/3531012.html; Supplier: LCSC; Number: 1 P-Channel; Drain to Source Voltage: 50V; Current - Continuous Drain(Id): 130mA; RDS(on): 10Ω@5V; Pd - Power Dissipation: 225mW; Gate Threshold Voltage (Vgs(th)): 2V@250uA; Input Capacitance(Ciss): 30pF; Reverse Transfer Capacitance (Crss@Vds): 5pF; Operating Temperature: -55℃~+150℃; Output Capacitance(Coss): 10pF
C8 C23 C24 = GRM188C81E475KE11D: LCSC Part Name: 4.7uF ±10% 25V; Supplier Part: C417145; Manufacturer: muRata(村田); Supplier Footprint: 0603; JLCPCB Part Class: Extended Part; Datasheet: https://item.szlcsc.com/datasheet/GRM188C81E475KE11D/410303.html; Supplier: LCSC; Tolerance: ±10%; Voltage Rating: 25V; Temperature Coefficient: X6S
CN3 CN5 CN7 CN16 CN18 = 15EDGVC-3.5-04P-14-00A(H): LCSC Part Name: 卡扣固定 1x4P 3.5mm 排数:1 每排P数:4; Supplier Part: C7466035; Manufacturer: DEGSON(高正/高松); Supplier Footprint: P=3.5mm; JLCPCB Part Class: Extended Part; Datasheet: https://item.szlcsc.com/datasheet/15EDGVC-3.5-04P-14-00A(H)/8508174.html; Supplier: LCSC; Connector Type: Board Side/Socket - Closed; Termination Style: Hinged (Snap On); Number of Positions or Pins: 1x4P; Pitch: 3.5mm; Color: Green; Mounting Type: Through Hole; Number of Pins: 4P; Number of Rows: 1; Number of PINs Per Row: 4; Current Rating: 8A; Voltage Rating (Max): 300V; Operating Temperature: -40℃~+105℃
CN99 = HDR-M_2.54_1x4P_C9900236824: Supplier Part: C9900236824; Supplier Footprint: HDR-TH_4P-P2.54-V-M; JLCPCB Part Class: Extended Part; Supplier: LCSC
D1 D2 = MBR0530T1G: LCSC Part Name: 电压:30V 电流:500mA; Supplier Part: C82046; Manufacturer: onsemi(安森美); Supplier Footprint: SOD-123; JLCPCB Part Class: Extended Part; Datasheet: https://item.szlcsc.com/datasheet/MBR0530T1G/83201.html; Supplier: LCSC; Voltage - Forward(Vf@If): 430mV@500mA; Voltage - DC Reverse(Vr): 30V; Current - Rectified: 500mA; Reverse Leakage Current (Ir): 130uA@30V; Operating Junction Temperature Range: -65℃~+125℃; Non-Repetitive Peak Forward Surge Current: 5.5A
R1-R3 R42 R57-R60 = 10K: Supplier Part: C9900011271; Supplier: LCSC
R6 R55 = WR08X152JTL: LCSC Part Name: 厚膜电阻 1.5kΩ ±5% 125mW; Supplier Part: C163951; Manufacturer: Walsin(华新科); Supplier Footprint: 0805; Datasheet: https://item.szlcsc.com/datasheet/WR08X152JTL/175333.html; Supplier: LCSC; Type: Thick Film Resistor; Tolerance: ±5%; Power(Watts): 125mW; Voltage-Supply(Max): 150V; Temperature Coefficient: ±100ppm/℃; Operating Temperature: -55℃~+155℃
U1 = STM32F415RGT6: LCSC Part Name: 带DSP和FPU的高性能基础系列ARM Cortex-M4 MCU，具有1 MB Flash、168 MHz CPU、ART加速器和硬件加密; Supplier Part: C124726; Manufacturer: ST(意法半导体); Supplier Footprint: LQFP-64(10x10); JLCPCB Part Class: Extended Part; Datasheet: https://atta.szlcsc.com/upload/public/pdf/source/20170810/C124726_1502335305434879862.pdf; Supplier: LCSC; CPU Core: ARM-M4; CPU Maximum Speed: 168MHz; Program Storage Size: 1MB; Program Memory Type: FLASH; Number of I/O: 51; ADC (Bit): 12bit; DAC (Bit): 12bit; Low Voltage Detection Threshold: 1.8V~3.6V
U2 = HCPL-063L-500E: LCSC Part Name: DC输入 2通道 隔离电压(rms):3750V; Supplier Part: C188704; Manufacturer: Broadcom(博通); Supplier Footprint: SO-8; JLCPCB Part Class: Extended Part; Datasheet: https://item.szlcsc.com/datasheet/HCPL-063L-500E/200112.html; Supplier: LCSC; Input Type: DC; Voltage - Supply: 2.7V~3.6V; Isolation Voltage(Vrms): 3.75kV; CMTI(kV/us): 15kV/us; Data Rate: 15Mbps; Number of Channels: 1; Operating Temperature: -40℃~+85℃; Low level Delay Time: 100ns; High level Delay Time: 75ns; Input threshold current: 5mA; power dissipation: 85mW
U26 = 24LC256-I/SM: Supplier Part: C1523846; Supplier Footprint: SOIJ-8; JLCPCB Part Class: Extended Part; Supplier: LCSC; Interface Type: I2C; Memory Size: 256Kbit; Clock Frequency (fc): 400kHz; Supply Voltage: 2.5V~5.5V; Write Cycle Time (Tw): 5ms; Operating Temperature: -40℃~+85℃
U57 = SP3485EN-L/TR: LCSC Part Name: SP3485 +3.3V低功耗半双工RS-485收发器，数据速率10Mbps; Supplier Part: C8963; Manufacturer: MaxLinear(迈凌); Supplier Footprint: SOIC-8; JLCPCB Part Class: Basic Part; Datasheet: https://item.szlcsc.com/datasheet/SP3485EN-L%252FTR/9482.html; Supplier: LCSC; Type: Transceiver; Number of Drivers: 1; Number of Receivers: 1; Voltage - Supply: 3.3V; Data Rate: 10Mbps; Number of Nodes: 32; Operating Temperature: -40℃~+85℃; Quiescent Supply Current: 2mA; Communication Mode: Half-Duplex; Features: Tx/Rx启用；使能关断；Overcurrent Protection
VT1-VT7 = 2N7002_3: Supplier Part: C23599986; Manufacturer: NXP(恩智浦); Supplier: LCSC
C44 C45 = GRM32DR71E106KA12L: LCSC Part Name: 10uF ±10% 25V; Supplier Part: C77100; Manufacturer: muRata(村田); Supplier Footprint: 1210; JLCPCB Part Class: Extended Part; Datasheet: https://atta.szlcsc.com/upload/public/pdf/source/20200305/C490387_23319AE8C154DEB24C505E6C82A8106A.pdf; Supplier: LCSC; Tolerance: ±10%
C47 = GRM21BR71E105KA99L: LCSC Part Name: 1uF ±10% 25V; Supplier Part: C77080; Manufacturer: muRata(村田); Supplier Footprint: 0805; JLCPCB Part Class: Extended Part; Datasheet: https://item.szlcsc.com/datasheet/GRM21BR71E105KA99L/78207.html; Supplier: LCSC; Tolerance: ±10%; Voltage Rating: 25V; Temperature Coefficient: X7R
C55-C58 = GCM188R72A103KA37D: LCSC Part Name: 10nF ±10% 100V; Supplier Part: C161232; Manufacturer: muRata(村田); Supplier Footprint: 0603; Datasheet: https://atta.szlcsc.com/upload/public/pdf/source/20180821/C161232_821413241D49F39417A0CF004BACE7E0.pdf; Supplier: LCSC; Tolerance: ±10%
L3 = ACMS201209A6012A: LCSC Part Name: 单路 0805磁珠 阻抗600Ω@100MHz; Supplier Part: C963878; Manufacturer: HYHONGYEX(宏业); Supplier Footprint: 0805; JLCPCB Part Class: Extended Part; Datasheet: https://item.szlcsc.com/datasheet/ACMS201209A6012A/1048421.html; Supplier: LCSC; Impedance @ Frequency: 600Ω@100MHz; Tolerance: ±25%; DC Resistance(DCR): 100mΩ; Current Rating: 2A; Number of Circuits: 1; Operating Temperature: -40℃~+85℃
L4 = LQH43CN220K03L: LCSC Part Name: 22uH ±10%; Supplier Part: C603126; Manufacturer: muRata(村田); Supplier Footprint: 1812; JLCPCB Part Class: Extended Part; Datasheet: https://item.szlcsc.com/datasheet/LQH43CN220K03L/632474.html; Supplier: LCSC; Tolerance: ±10%; Current Rating: 420mA; DC Resistance(DCR): 600mΩ
PW1 = H1209S-1W: Supplier Part: C5200008; Manufacturer: JETEKPS(健特); Supplier Footprint: SIP,19.6x9.5mm; JLCPCB Part Class: Extended Part; Datasheet: https://item.szlcsc.com/datasheet/H1209S-1W/5886737.html; Supplier: LCSC; Function: Buck; Number of Channels: 1; Output Power: 1W; Voltage - Supply: 10.8V~13.2V; Conversion Efficiency: 76%; Output Voltage: 9V; Output Current(Max): 111mA; Capacitive Load(Max): 1000uF; Isolation Voltage(Vrms): 6kV; Features: Short Circuit Protection；Over Temperature Protection; Operating Temperature: -40℃~+85℃; No-Load Input Current: 8mA; Ripple Noise: 100mVp-p
R33 = RNCF0805TKY10K0: LCSC Part Name: 薄膜电阻 10kΩ ±0.01% 125mW; Supplier Part: C346563; Manufacturer: SEI(Stackpole Electronics Inc.); Supplier Footprint: 0805; Datasheet: https://item.szlcsc.com/datasheet/RNCF0805TKY10K0/323229.html; Supplier: LCSC; Type: Thin Film Resistor; Tolerance: ±0.01%; Power(Watts): 125mW; Temperature Coefficient: ±5ppm/℃; Operating Temperature: -55℃~+155℃
R34-R37 = TNPW06031K00BEEA: LCSC Part Name: 薄膜电阻 1kΩ ±0.1% 210mW; Supplier Part: C844891; Manufacturer: VISHAY(威世); Supplier Footprint: 0603; JLCPCB Part Class: Extended Part; Datasheet: https://item.szlcsc.com/datasheet/TNPW06031K00BEEA/904465.html; Supplier: LCSC; Type: Thin Film Resistor; Tolerance: ±0.1%; Power(Watts): 210mW; Voltage-Supply(Max): 75V; Temperature Coefficient: ±25ppm/℃; Operating Temperature: -55℃~+155℃
U31 = ADS1220IPW: Supplier Part: C1542855; Manufacturer: TI(德州仪器); Supplier Footprint: TSSOP-16; JLCPCB Part Class: Extended Part; Datasheet: https://www.ti.com/cn/lit/gpn/ads1220; Supplier: LCSC; resolution: 24Bit; sampling frequency: 2kHz; number of channels: 4; Supply Voltage: 2.3V~5.5V; Interface: SPI; differential input: Yes; Operating Temperature: -40℃~+125℃
U32 = REF195FS REEL: Supplier Part: C3679663; Manufacturer: ADI(亚德诺); Supplier Footprint: SOIC-8; JLCPCB Part Class: Extended Part; Datasheet: https://atta.szlcsc.com/upload/public/pdf/source/20231009/7D7BF54E1B1DCF74733244044314FF3B.pdf; Supplier: LCSC; Output Type: Fixed; Input Voltage: 18V; Output Voltage: 5V; Output Current: 30mA; Tolerance: ±0.1%; Temperature Coefficient: 10ppm/℃; Reference Type: series connection; Supply Current: 45uA; Noise - 1/10Hz to 10Hz: 50uVp-p; Operating Temperature: -40℃~+85℃@(Ta)
U34 = MCP1702T-5002E/CB: LCSC Part Name: 输入13.2V 输出5V 250mA; Supplier Part: C180192; Manufacturer: MICROCHIP(美国微芯); Supplier Footprint: SOT-23A-3; JLCPCB Part Class: Extended Part; Datasheet: https://item.szlcsc.com/datasheet/MCP1702T-5002E%252FCB/191587.html; Supplier: LCSC; Output Type: Fixed; Voltage - Supply: 13.2V; Output Voltage: 5V; Output Current: 250mA; Power Supply Rejection Ratio (PSRR): 44dB@(100Hz); Voltage Dropout: 330mV@(250mA); standby current: 2uA; Features: Over Current Protection；Short Circuit Protection；Over Temperature Protection; Operating Temperature: -40℃~+125℃@(Tj); Output Configuration: Positive; Number of Outputs: 1
U35 = ISO6762FDWR: LCSC Part Name: 通用、50Mbps、六通道(4/2) 数字隔离器; Supplier Part: C5216396; Manufacturer: TI(德州仪器); Supplier Footprint: SOIC-16; JLCPCB Part Class: Extended Part; Datasheet: https://www.ti.com/cn/lit/gpn/iso6760; Supplier: LCSC; Number of Forward Channels: 6; Number of Reverse Channels: 0; Data Rate(Max): 50Mbps; Default Output: Low Level; Isolation Voltage(Vrms): 5000; CMTI(kV/us): 150kV/us; Propagation Delay(tpd): 11ns; Voltage - Supply(VCCA): 2.25V~5.5V; Voltage - Supply(VCCB): 2.25V~5.5V; Operating Temperature: -40℃~+125℃
C19 C20 = CL31A106KBHNNNE: LCSC Part Name: 10uF ±10% 50V; Supplier Part: C13585; Manufacturer: SAMSUNG(三星); Supplier Footprint: 1206; JLCPCB Part Class: Basic Part; Datasheet: https://item.szlcsc.com/datasheet/CL31A106KBHNNNE/14236.html; Supplier: LCSC; Tolerance: ±10%; Voltage Rating: 50V; Temperature Coefficient: X5R
C21 C22 = CC0805JRNPO9BN471: LCSC Part Name: 470pF ±5% 50V; Supplier Part: C62771; Manufacturer: YAGEO(国巨); Supplier Footprint: 0805; Datasheet: https://item.szlcsc.com/datasheet/CC0805JRNPO9BN471/63833.html; Supplier: LCSC; Tolerance: ±5%; Voltage Rating: 50V; Temperature Coefficient: NP0
C35 = GRM31CR61H106KA12L: LCSC Part Name: 10uF ±10% 50V; Supplier Part: C77092; Manufacturer: muRata(村田); Supplier Footprint: 1206; JLCPCB Part Class: Extended Part; Datasheet: https://item.szlcsc.com/datasheet/GRM31CR61H106KA12L/78219.html; Supplier: LCSC; Tolerance: ±10%; Voltage Rating: 50V; Temperature Coefficient: X5R
C37 C38 = GRM31CR61C226KE15L: LCSC Part Name: 22uF ±10% 16V 停产; Supplier Part: C77088; Manufacturer: muRata(村田); Supplier Footprint: 1206; JLCPCB Part Class: Extended Part; Datasheet: https://item.szlcsc.com/datasheet/GRM31CR61C226KE15L/78215.html; Supplier: LCSC; Tolerance: ±10%; Voltage Rating: 16V; Temperature Coefficient: X5R
C39 = CC0805JRNPO9BN750: LCSC Part Name: 75pF ±5% 50V; Supplier Part: C113832; Manufacturer: YAGEO(国巨); Supplier Footprint: 0805; JLCPCB Part Class: Extended Part; Datasheet: https://item.szlcsc.com/datasheet/CC0805JRNPO9BN750/115068.html; Supplier: LCSC; Tolerance: ±5%; Voltage Rating: 50V; Temperature Coefficient: NP0
C59 = CC0805KRX7R9BB223: LCSC Part Name: 22nF ±10% 50V; Supplier Part: C107147; Manufacturer: YAGEO(国巨); Supplier Footprint: 0805; JLCPCB Part Class: Extended Part; Datasheet: https://item.szlcsc.com/datasheet/CC0805KRX7R9BB223/108363.html; Supplier: LCSC; Tolerance: ±10%; Voltage Rating: 50V; Temperature Coefficient: X7R
C60 = C0805C684K5RACTU: LCSC Part Name: 680nF ±10% 50V; Supplier Part: C22402009; Manufacturer: KEMET(基美); Supplier Footprint: 0805; JLCPCB Part Class: Extended Part; Datasheet: https://item.szlcsc.com/datasheet/C0805C684K5RACTU/24025619.html; Supplier: LCSC; Tolerance: ±10%; Voltage Rating: 50V; Temperature Coefficient: X7R
C62 = CC0805KKX7R7BB474: LCSC Part Name: 470nF ±10% 16V; Supplier Part: C106845; Manufacturer: YAGEO(国巨); Supplier Footprint: 0805; JLCPCB Part Class: Extended Part; Datasheet: https://item.szlcsc.com/datasheet/CC0805KKX7R7BB474/108061.html; Supplier: LCSC; Tolerance: ±10%; Voltage Rating: 16V; Temperature Coefficient: X7R
C63 = B32921C3103K000: LCSC Part Name: X2 10nF ±10% 305VAC; Supplier Part: C341267; Supplier Footprint: 插件; JLCPCB Part Class: Extended Part; Supplier: LCSC
CN1 CN17 = 2EDGV-5.08-02P-14-100A(H): LCSC Part Name: 1x2P 5.08mm 排数:1 每排P数:2; Supplier Part: C581326; Manufacturer: DEGSON(高正/高松); Supplier Footprint: 插件,P=5.08mm; JLCPCB Part Class: Extended Part; Datasheet: https://item.szlcsc.com/datasheet/2EDGV-5.08-02P-14-100A(H)/609127.html; Supplier: LCSC; Connector Type: Board Side/Socket - Open; Number of Positions or Pins: 1x2P; Pitch: 5.08mm; Color: Green; Mounting Type: Through Hole; Number of Pins: 2P; Number of Rows: 1; Number of PINs Per Row: 2; Current Rating: 15A; Voltage Rating (Max): 300V; Operating Temperature: -40℃~+105℃
CN2 CN9-CN12 = MX15EDGVC-3.5-03P-GN01-Cu-A: LCSC Part Name: 1x3P 3.5mm 排数:1 每排P数:3; Supplier Part: C5188319; Manufacturer: MAX(迈旭); Supplier Footprint: 插件,P=3.5mm; JLCPCB Part Class: Extended Part; Datasheet: https://item.szlcsc.com/datasheet/MX15EDGVC-3.5-03P-GN01-Cu-A/5862403.html; Supplier: LCSC; Connector Type: Board Side/Socket - Closed; Number of Positions or Pins: 1x3P; Pitch: 3.5mm; Color: Green; Mounting Type: Through Hole; Number of Pins: 3P; Number of Rows: 1; Number of PINs Per Row: 3; Current Rating: 8A; Voltage Rating (Max): 300V; Operating Temperature: -40℃~+105℃
F1 = 5x20 BLX-A型 保险丝支架 XC-7: LCSC Part Name: 保险丝座 5x20 BLX-A型; Supplier Part: C3131; Manufacturer: xcfuse(旭程); Supplier Footprint: 插件; JLCPCB Part Class: Extended Part; Datasheet: https://item.szlcsc.com/datasheet/5x20%2520BLX-A%25E5%259E%258B%2520%25E4%25BF%259D%25E9%2599%25A9%25E4%25B8%259D%25E6%2594%25AF%25E6%259E%25B6%2520XC-7/3520.html; Supplier: LCSC; Fuseholder Type: Bracket type; Number of Circuits: 1; Voltage Rating: 250V; Current Rating: 6.3A; Fuse Type: Cylindrical; Fuse Diameter (φD): 5.2mm; Fuse Length: 20mm
L1 = NRS4018T100MDGJ: LCSC Part Name: 10uH ±20% 1.3A; Supplier Part: C222882; Manufacturer: TAIYO YUDEN(太诱); Supplier Footprint: SMD,4x4mm; JLCPCB Part Class: Extended Part; Datasheet: https://atta.szlcsc.com/upload/public/pdf/source/20210429/D283EEC4B2B32E0C06ACD7E308182B38.pdf; Supplier: LCSC; Tolerance: ±20%; Saturation Current (Isat): 1.3A
L2 = 电感68uH(丝印680)-CD74R: Supplier Part: C9900005374; JLCPCB Part Class: Extended Part; Supplier: LCSC
Q7 = BTA216B-600E,118: Supplier Part: C602946; Manufacturer: WeEn(瑞能); Supplier Footprint: SOT-404; JLCPCB Part Class: Extended Part; Datasheet: https://atta.szlcsc.com/upload/public/pdf/source/20210408/C602945_EF1AD768E19EB3B3CAF7CEF89AE2BA59.pdf; Supplier: LCSC; Gate Trigger   Voltage (Vgt): 1.5V; Holding Current (Ih): 25mA; Peak Repetitive Off?State Voltage (Vdrm): 600V; Gate Trigger Current(Igt): 10mA; RMS On-State Current(It (rms)): 16A
R5 R43 = RC1206FR-07360RL: LCSC Part Name: 厚膜电阻 360Ω ±1% 250mW; Supplier Part: C163378; Manufacturer: YAGEO(国巨); Supplier Footprint: 1206; JLCPCB Part Class: Extended Part; Datasheet: https://item.szlcsc.com/datasheet/RC1206FR-07360RL/174759.html; Supplier: LCSC; Type: Thick Film Resistor; Tolerance: ±1%; Power(Watts): 250mW; Voltage-Supply(Max): 200V; Temperature Coefficient: ±100ppm/℃; Operating Temperature: -55℃~+155℃
R30 = RC0805FR-07100KL: LCSC Part Name: 厚膜电阻 100kΩ ±1% 125mW; Supplier Part: C96346; Manufacturer: YAGEO(国巨); Supplier Footprint: 0805; JLCPCB Part Class: Extended Part; Datasheet: https://item.szlcsc.com/datasheet/RC0805FR-07100KL/97550.html; Supplier: LCSC; Type: Thick Film Resistor; Tolerance: ±1%; Power(Watts): 125mW; Voltage-Supply(Max): 150V; Temperature Coefficient: ±100ppm/℃; Operating Temperature: -55℃~+155℃
R31 = CRCW080513K3FKEA: LCSC Part Name: 厚膜电阻 13.3kΩ ±1% 125mW; Supplier Part: C4359485; Manufacturer: VISHAY(威世); Supplier Footprint: 0805; JLCPCB Part Class: Extended Part; Datasheet: https://item.szlcsc.com/datasheet/CRCW080513K3FKEA/4930395.html; Supplier: LCSC; Type: Thick Film Resistors; Tolerance: ±1%; Power(Watts): 125mW; Temperature Coefficient: ±100ppm/℃; Operating Temperature: -55℃~+155℃
R32 = RC0805FR-0749R9L: LCSC Part Name: 厚膜电阻 49.9Ω ±1% 125mW; Supplier Part: C132320; Manufacturer: YAGEO(国巨); Supplier Footprint: 0805; JLCPCB Part Class: Extended Part; Datasheet: https://item.szlcsc.com/datasheet/RC0805FR-0749R9L/143619.html; Supplier: LCSC; Type: Thick Film Resistor; Tolerance: ±1%; Power(Watts): 125mW; Voltage-Supply(Max): 150V; Temperature Coefficient: ±100ppm/℃; Operating Temperature: -55℃~+155℃
R39 R45-R47 R61 R62 = AC0805FR-071KL: LCSC Part Name: 厚膜电阻 1kΩ ±1% 125mW; Supplier Part: C140870; Manufacturer: YAGEO(国巨); Supplier Footprint: 0805; JLCPCB Part Class: Extended Part; Datasheet: https://atta.szlcsc.com/upload/public/pdf/source/20180927/C229861_4ABDC471507C1ED6AFB4BA66AFC8620A.pdf; Supplier: LCSC; Type: Thick Film Resistors; Tolerance: ±1%; Temperature Coefficient: ±100ppm/℃; Operating Temperature Range: -55℃~+155℃
R40 = RC0805JR-072K2L: LCSC Part Name: 厚膜电阻 2.2kΩ ±5% 125mW; Supplier Part: C114237; Manufacturer: YAGEO(国巨); Supplier Footprint: 0805; Datasheet: https://item.szlcsc.com/datasheet/RC0805JR-072K2L/115477.html; Supplier: LCSC; Type: Thick Film Resistor; Tolerance: ±5%; Power(Watts): 125mW; Voltage-Supply(Max): 150V; Temperature Coefficient: ±100ppm/℃; Operating Temperature: -55℃~+155℃
R41 R50 = RC0805JR-07240RL: LCSC Part Name: 厚膜电阻 240Ω ±5% 125mW; Supplier Part: C114225; Manufacturer: YAGEO(国巨); Supplier Footprint: 0805; JLCPCB Part Class: Extended Part; Datasheet: https://item.szlcsc.com/datasheet/RC0805JR-07240RL/115465.html; Supplier: LCSC; Type: Thick Film Resistor; Tolerance: ±5%; Power(Watts): 125mW; Voltage-Supply(Max): 150V; Temperature Coefficient: ±100ppm/℃; Operating Temperature: -55℃~+155℃
R44 = B72210S0271K101: LCSC Part Name: 插件压敏电阻; Supplier Part: C125511; Manufacturer: TDK; Supplier Footprint: 插件,P=7.5mm; JLCPCB Part Class: Extended Part; Datasheet: https://item.szlcsc.com/datasheet/B72210S0271K101/136788.html; Supplier: LCSC; Varistor Voltage: 430V; Clamping Voltage: 710V; Maximum DC Volts: 350V; Maximum AC Volts: 275V; Peak Current: 2.5kA; Energy: 43J; Rated Wattage: 400mW; Pitch: 7.5mm
R48 R49 = RC0805FR-071K5L: LCSC Part Name: 厚膜电阻 1.5kΩ ±1% 125mW; Supplier Part: C114555; Manufacturer: YAGEO(国巨); Supplier Footprint: 0805; Datasheet: https://item.szlcsc.com/datasheet/RC0805FR-071K5L/115799.html; Supplier: LCSC; Type: Thick Film Resistor; Tolerance: ±1%; Power(Watts): 125mW; Voltage-Supply(Max): 150V; Temperature Coefficient: ±100ppm/℃; Operating Temperature: -55℃~+155℃
R51 = RC0805FR-076K8L: LCSC Part Name: 厚膜电阻 6.8kΩ ±1% 125mW; Supplier Part: C114550; Manufacturer: YAGEO(国巨); Supplier Footprint: 0805; Datasheet: https://item.szlcsc.com/datasheet/RC0805FR-076K8L/115794.html; Supplier: LCSC; Type: Thick Film Resistor; Tolerance: ±1%; Power(Watts): 125mW; Voltage-Supply(Max): 150V; Temperature Coefficient: ±100ppm/℃; Operating Temperature: -55℃~+155℃
R52 = RC0805FR-0715KL: LCSC Part Name: 厚膜电阻 15kΩ ±1% 125mW; Supplier Part: C114559; Manufacturer: YAGEO(国巨); Supplier Footprint: 0805; Datasheet: https://item.szlcsc.com/datasheet/RC0805FR-0715KL/115803.html; Supplier: LCSC; Type: Thick Film Resistor; Tolerance: ±1%; Power(Watts): 125mW; Voltage-Supply(Max): 150V; Temperature Coefficient: ±100ppm/℃; Operating Temperature: -55℃~+155℃
U13 U14 = LDK130M33R: LCSC Part Name: 3.3V 300mA 5.5V; Supplier Part: C2969807; Manufacturer: ST(意法半导体); Supplier Footprint: SOT-23-5L; JLCPCB Part Class: Extended Part; Datasheet: https://item.szlcsc.com/datasheet/LDK130M33R/3362271.html; Supplier: LCSC; Output Configuration: Positive; Voltage - Supply: 5.5V; Output Voltage: 3.3V; Output Current: 300mA; Power Supply Rejection Ratio (PSRR): 55dB@(10kHz); Voltage Dropout: 400mV@(300mA); standby current: 30uA; Features: Enable control；Short Circuit Protection；Over Current Protection；Noise bypass terminal；Thermal shutdown; Operating Temperature: -40℃~+125℃@(Tj); Output Type: Fixed; Number of Outputs: 1
U27 = TPS54202DDCT: LCSC Part Name: 降压型 2A 4.5V~28V; Supplier Part: C2070672; Manufacturer: TI(德州仪器); Supplier Footprint: TSOT-23-6; JLCPCB Part Class: Extended Part; Datasheet: https://www.ti.com/cn/lit/gpn/tps54202; Supplier: LCSC; Function: Step-down type; Voltage - Supply: 4.5V~28V; Output Voltage: 596mV~28V; Output Current: 2A; Frequency - Switching: 500kHz; Operating Temperature: -40℃~+125℃@(TJ); Synchronous Rectifier: Yes; Number of Outputs: 1; Topology: Buck; Quiescent Current: 45uA; Switch tube (built-in/external): Built-in; Output Type: Adjustable; Features: Light load efficient mode；Cycle-by-cycle current limiting；Overcurrent Protection；EMI optimization (spread spectrum)；Hiccup current limiting
U38 = LTC2954ITS8-2#TRMPBF: LCSC Part Name: 具微处理器中断功能的按钮接通/关断控制器; Supplier Part: C580655; Manufacturer: ADI(亚德诺); Supplier Footprint: TSOT-23-8; JLCPCB Part Class: Extended Part; Datasheet: https://item.szlcsc.com/datasheet/LTC2954ITS8-2%2523TRMPBF/608432.html; Supplier: LCSC
U39 = IRM-01-5: Supplier Part: C5656515; Manufacturer: MW(明纬); Supplier Footprint: DIP,33.7x22.2mm; JLCPCB Part Class: Extended Part; Datasheet: https://item.szlcsc.com/datasheet/IRM-01-5/6577470.html; Supplier: LCSC
U49 = MOC3063S: Supplier Part: C6992515; Manufacturer: LITEON(光宝); Supplier Footprint: SMD-6P; JLCPCB Part Class: Extended Part; Datasheet: https://atta.szlcsc.com/upload/public/pdf/source/20180912/C282419_88B0F7464B1B94982555373A01F18D0C.pdf; Supplier: LCSC; Zero Crossing Circuit: 有; Forward Voltage: 1.2V; Isolation Voltage(rms): 5kV; Forward Current: 50mA; Peak Off-state Voltage(Vdrm): 600V; Static dv/dt: 1000V/us; Number of Outputs: 1; Operating Temperature: -40℃~+100℃
U51 = MOF1W-33Ω±5%T: LCSC Part Name: 金属氧化膜电阻 33Ω ±5% 1W; Supplier Part: C714386; Manufacturer: 华星机电; Manufacturer Part: M01R470JT@CCO, RESMOF-1W-47R-J; Supplier Footprint: 插件,D4.5xL11.5mm; JLCPCB Part Class: Extended Part; Datasheet: https://atta.szlcsc.com/upload/public/pdf/source/20200731/C714437_ED64FE5D812441F23A9429C6C905B5FB.pdf; Supplier: LCSC; Type: Metal Oxide Resistors; Tolerance: ±5%; Power(Watts): 1W; Temperature Coefficient: ±700ppm/℃
U52-U56 = GCX-C0805UGC: Supplier Part: C9900020292; Supplier Footprint: LED0805; JLCPCB Part Class: Extended Part; Supplier: LCSC
R15-R18 = RC0805JR-0739KL: LCSC Part Name: 厚膜电阻 39kΩ ±5% 125mW; Supplier Part: C137440; Manufacturer: YAGEO(国巨); Supplier Footprint: 0805; JLCPCB Part Class: Extended Part; Datasheet: https://item.szlcsc.com/datasheet/RC0805JR-0739KL/148756.html; Supplier: LCSC; Type: Thick Film Resistor; Tolerance: ±5%; Power(Watts): 125mW; Voltage-Supply(Max): 150V; Temperature Coefficient: ±100ppm/℃; Operating Temperature: -55℃~+155℃
VT11-VT16 = BC847: Supplier Part: C2913847; Supplier Footprint: SOT-23; JLCPCB Part Class: Extended Part; Supplier: LCSC

## Nets
GND: C1.1 C2.1 C3.1 C4.1 C5.1 C6.1 C7.1 C8.1 C9.1 C10.2 C11.1 C15.1 C16.2 C17.1 C19.1 C20.1 C21.1 C22.1 C23.1 C24.1 C25.1 C26.1 C30.1 C31.2 C32.1 C33.2 C34.1 C35.2 C37.1 C38.1 C40.2 C59.1 C60.2 C61.2 C62.1 C64.1 CN2.3 CN3.4 CN4.3 CN7.2 CN8.2 CN9.3 CN10.3 CN11.3 CN12.3 CN13.5 CN14.5 CN15.2 CN16.4 CN18.1 CN99.1 D1.2(A) D2.2(A) PW1.2(GND) R2.1 R4.1 R9.1 R19.1 R20.1 R21.1 R22.1 R31.1 R38.1 R39.1 R53.1 R54.1 R56.1 R57.1 U1.12(VSSA) U1.18(VSS) U1.63(VSS) U2.2(CATHODE1) U2.3(CATHODE2) U2.5(GND) U4.15(GND) U12.2(GND) U12.6(VIN-) U13.2(GND) U14.2(GND) U25.15(GND) U26.1(A0) U26.2(A1) U26.3(A2) U26.4(VSS) U26.7(WP) U27.1(GND) U35.8(GND1) U38.4(GND) U39.13(-V) U52.2(C) U53.2(C) U55.2(C) U56.2(C) U57.5(GND) VT2.2(S) VT3.2(S) VT4.2(S) VT5.2(S) VT6.2(S) VT7.2(S) VT11.2(E) VT12.2(E) VT13.2(E) VT14.2(E) VT15.2(E) VT16.2(E)
GNDPT: C41.2 C42.2 C43.2 C44.1 C45.1 C46.1 C47.1 C48.1 C49.1 C50.1 C51.1 C52.1 C55.1 C56.2 C57.1 C58.2 PW1.5(0V) R33.1 R35.1 U31.3(CLK) U31.4(DGND) U31.5(AVSS) U32.4(GND) U34.1(GND) U35.9(GND2)
V3: C3.2 C4.2 C5.2 C6.2 C7.2 C8.2 C9.2 C10.1 C14.1 C16.1 C17.2 C23.2 C29.1 C31.1 C32.2 C33.1 C40.1 C64.2 CN99.4 R1.2 R3.2 R7.2 R8.2 R11.1 R12.1 R13.2 R14.2 R23.2 R24.2 R25.2 R26.2 R27.2 R28.2 R29.2 R41.2 R50.2 R60.1 U1.1(VBAT) U1.13(VDDA) U1.19(VDD) U1.32(VDD) U1.48(VDD) U1.64(VDD) U2.8(VCC) U4.16(VCC) U13.5(OUT) U25.16(VCC) U26.8(VCC) U35.1(VCC1) U57.8(VCC) VT9.2(S) VT10.2(S)
V3A: C24.2 C26.2 D3.3(A) U12.5(VDD) U14.5(OUT)
V5: C37.2 C38.2 L2.2 R32.2 U13.1(IN) U13.3(EN) U14.1(IN) U14.3(EN)
V5APT: C49.2 C50.2 C52.2 U31.12(AVDD) U32.6(OUTPUT)
V5PT: C41.1 C43.1 C48.2 U31.13(DVDD) U34.2(VOUT) U35.16(VCC2)
V5STB: C61.1 R42.2 R48.2 R58.2 R59.2 U38.1(VIN) U39.12(+V) VT8.2(S)
V9PT: C42.1 C44.2 L4.1 PW1.7(+VO) U34.3(VIN)
V12: C19.2 CN2.2 CN7.4 CN9.1 CN10.1 CN11.1 CN12.1 CN13.1 CN14.1 CN16.1 L1.1 R51.2
V12F: C20.2 C34.2 C35.1 CN6.1 CN18.4 L1.2 PW1.1(VIN) U27.3(VIN)
V24: CN2.1 CN3.3 R52.2
ACL: C63.2 CN17.2 Q7.2(T2) R43.2 R44.2 U39.1(AC/L)
ACN: CN1.1 CN17.1 U39.24(AC/N)
AIN0PT: C54.1 C55.2 R37.2 U31.11(AIN0/REFP1)
AIN1PT: C54.2 C56.1 R36.2 U31.10(AIN1)
APM_A: CN18.3 U57.6(A)
APM_B: CN18.2 U57.7(B)
APM_DE: U1.20(PA4) U57.2(RE#) U57.3(DE)
APM_RX: U1.17(PA3) U57.1(RO)
APM_TX: U1.16(PA2) U57.4(DI)
AUTO: R13.1 U1.2(PC13) VT16.3(C)
BOOT0: R2.2 U1.60(BOOT0) VT10.3(D)
BTNLED: CN16.2 R62.2
BTNLEDSIGNAL: R54.2 U1.36(PB15) VT6.1(G)
BTNPRESS: R60.2 U1.22(PA6) U38.5(INT#)
BTNSIG: CN16.3 R59.1 U38.2(PB#)
C1M: C12.1 U4.3(C1-)
C1MLASER: C27.1 U25.3(C1-)
C1P: C12.2 U4.1(C1+)
C1PLASER: C27.2 U25.1(C1+)
C2M: C13.1 U4.5(C2-)
C2MLASER: C28.1 U25.5(C2-)
C2P: C13.2 U4.4(C2+)
C2PLASER: C28.2 U25.4(C2+)
CSPT: U1.61(PB8) U35.3(INB)
CSPTI: U31.2(CS#) U35.14(OUTB)
DINPT: U1.57(PB5) U35.4(INC)
DINPTI: U31.16(DIN) U35.13(OUTC)
DIR: R56.2 U1.15(PA1) VT3.1(G)
DIROUT: CN13.3 R46.1
DOUTLASER: CN14.2 R27.1 VT9.1(G)
DOUTPT: U1.56(PB4(NJTRST)) U35.6(OUTE)
DOUTPTI: U31.15(DOUT/DRDY#) U35.11(INE)
DRDYPT: U1.54(PD2) U35.7(OUTF)
DRDYPTI: U31.14(DRDY#) U35.10(INF)
ENAB: R38.2 U1.21(PA5) VT4.1(G)
ENABOUT: CN13.2 R47.1
FB1: C39.1 R30.1 R31.2 U27.4(FB)
IN420: C25.2 D3.1(K) D3.2(K) R10.1 U12.1(VIN+)
KILL: R58.1 U38.8(KILL#) VT7.3(D)
KILLSIG: R40.2 U1.23(PA7)
LASEROUT: U1.39(PC8) VT9.3(D)
MOTORLED: CN7.3 R61.2
MOTORLEDSIGNAL: R53.2 U1.4(PC15-OSC32_OUT(PC15)) VT5.1(G)
NRST: C11.2 R3.1 U1.7(NRST) VT1.3(D)
NRST_E: U1.45(PA12) VT1.1(G)
PCDTR: CN4.1 R55.1
PCRTS: CN4.2 R6.1
POSITION0: R23.1 U1.8(PC0) VT14.3(C)
POSITION1: R24.1 U1.9(PC1) VT11.3(C)
POSITION2: R25.1 U1.10(PC2) VT12.3(C)
POSITION3: R26.1 U1.11(PC3) VT13.3(C)
PWREN: R42.1 U38.6(EN/EN#) VT8.1(G)
REDPWR: CN5.4 U31.6(AIN3/REFN1)
REDSIG: CN5.3 R36.1
REFNPT: C53.1 C57.2 R35.2 U31.8(REFN0)
REFPPT: C53.2 C58.1 R34.2 U31.9(REFP0)
RELAY: CN15.1 R39.2 R49.2 VT8.3(D)
RX3: U1.52(PC11) U4.9(R2OUT)
RXLASER: U1.38(PC7) U25.9(R2OUT)
RXLASEROUT: CN14.4 U25.8(R2IN)
RXVAC: U1.43(PA10) U4.12(R1OUT)
RXVACIN: CN3.2 U4.13(R1IN)
SCL420: R11.2 U1.29(PB10) U12.3(SCL)
SCLFLASH: R28.1 U1.58(PB6) U26.6(SCL)
SCLPT: U1.55(PB3(JTDOTRACESWO)) U35.2(INA)
SCLPTI: U31.1(SCLK) U35.15(OUTA)
SDA420: R12.2 U1.30(PB11) U12.4(SDA)
SDAFLASH: R29.1 U1.59(PB7) U26.5(SDA)
STEP: R4.2 U1.14(PA0-WKUP(PA0)) VT2.1(G)
STEPOUT: CN13.4 R45.1
SW1: C36.1 L2.1 U27.2(SW)
SWCLK: CN99.3 U1.49(PA14(JTCK-SWCLK))
SWDIO: CN99.2 U1.46(PA13(JTMS-SWDIO))
T2OUT: CN4.4 U4.7(T2OUT)
TX3: U1.51(PC10) U4.10(T2IN)
TXLASER: U1.37(PC6) U25.10(T2IN)
TXLASEROUT: CN14.3 U25.7(T2OUT)
TXVAC: U1.42(PA9) U4.11(T1IN)
TXVACOUT: CN3.1 U4.14(T1OUT)
VCAP1: C1.2 U1.31(VCAP_1)
VCAP2: C2.2 U1.47(VCAP_2)
VENTBTN: R14.1 U1.3(PC14-OSC32_IN(PC14)) VT15.3(C)
VENTSIG: U1.40(PC9) U49.2(CAT) U54.2(C)
WHITEPWR: CN5.1 R33.2 R34.1
WHITESIG: CN5.2 R37.1
$1N2499: U2.6(V02) VT1.2(S)
$1N2603: R1.1 U2.7(V01) VT10.1(G)
$1N3031: D2.1(C) R6.2 U2.4(ANODE2)
$1N3070: D1.1(C) R55.2 U2.1(ANODE1)
$1N3165: CN4.5 U4.8(R2IN)
$1N5159: C15.2 U4.6(V-)
$1N5163: C14.2 U4.2(V+)
$2N365: CN6.2 R9.2 R10.2
$3N536: R45.2 VT2.3(D)
$3N549: R46.2 VT3.3(D)
$3N1088: CN8.1 R7.1 VT15.1(B)
$3N1101: CN7.1 R8.1 VT16.1(B)
$3N2598: R15.1 R19.2 VT14.1(B)
$3N2637: R16.1 R20.2 VT11.1(B)
$3N2676: R17.1 R21.2 VT12.1(B)
$3N2715: R18.1 R22.2 VT13.1(B)
$3N2760: CN9.2 R15.2
$3N2764: CN10.2 R16.2
$3N2769: CN11.2 R17.2
$3N2774: CN12.2 R18.2
$3N5775: R47.2 VT4.3(D)
$3N22150: R61.1 VT5.3(D)
$3N22166: R62.1 VT6.3(D)
$4N516: C29.2 U25.2(V+)
$4N518: C30.2 U25.6(V-)
$5N535: C22.2 U14.4(BYP)
$5N537: C21.2 U13.4(BYP)
$5N1015: C36.2 U27.6(BOOT)
$5N1449: C39.2 R30.2 R32.1
$5N2727: C59.2 U38.3(ONT)
$5N2814: C60.1 U38.7(PDT)
$5N3438: C62.2 R40.1 R57.2 VT7.1(G)
$5N6261: R41.1 U49.1(AN)
$5N6628: Q7.3(G) R5.1 U49.4(MT1)
$5N6634: R43.1 U49.6(MT2)
$5N6934: C63.1 U51.2
$5N9639: F1.2 Q7.1(T1) R5.2 R44.1 U51.1
$5N9642: CN1.2 F1.1
$5N16901: R48.1 U52.1(A)
$5N16906: R49.1 U53.1(A)
$5N17018: R50.1 U54.1(A)
$5N17144: R51.1 U55.1(A)
$5N17246: R52.1 U56.1(A)
$6N1791: C45.2 C46.2 L3.1 L4.2
$6N1813: C47.2 C51.2 L3.2 U32.2(VS) U32.3(SLEEP#)

Not connected (* = marked no-connect by the designer): U1 5(PH0-OSC_IN(PH0)) 6(PH1-OSC_OUT(PH1)) 24(PC4) 25(PC5) 26(PB0) 27(PB1) 28(PB2-BOOT1(PB2)) 33(PB12) 34(PB13) 35(PB14) 41(PA8) 44(PA11) 50(PA15(JTDI)) 53(PC12) 62(PB9); U25 11(T1IN) 12(R1OUT) 13(R1IN) 14(T1OUT); U27 5(EN)*; U31 7(AIN2); U32 1(TP)* 5(TP)* 7(NC)* 8(NC)*; U35 5(IND)* 12(OUTD)*; U49 3(NC)* 5(NC)*
